# EAGLE design RK628H-22P-RevA (EAGLE 9.7.0)

## Sheet 1 of 6: Title Page
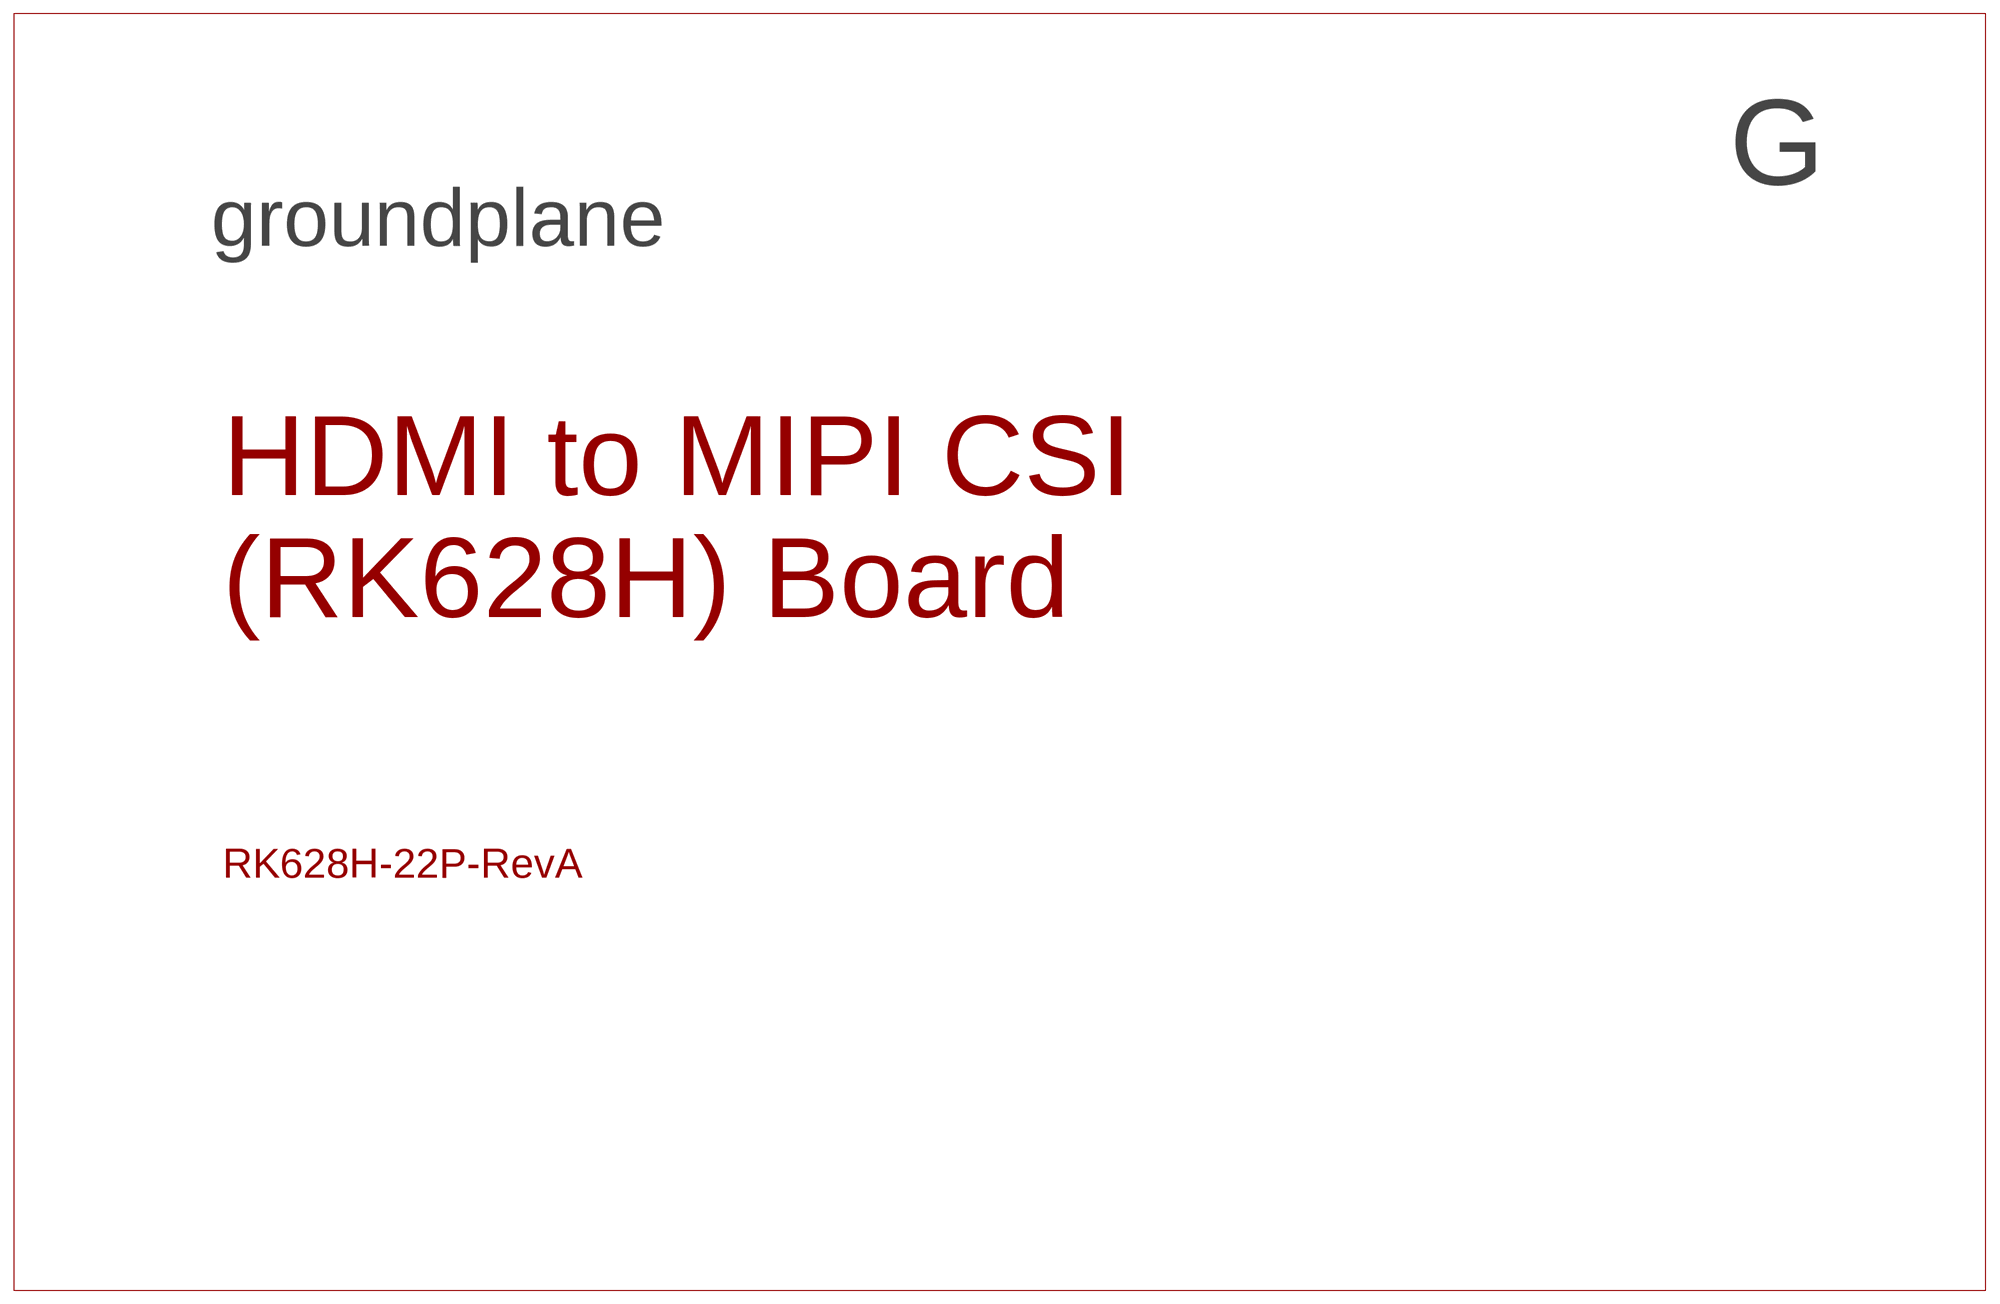
[diagram p0: schematic, sheet 1]

### Notes on the sheet
- HDMI to MIPI CSI 
  (RK628H) Board

## Sheet 2 of 6: Table of Contents
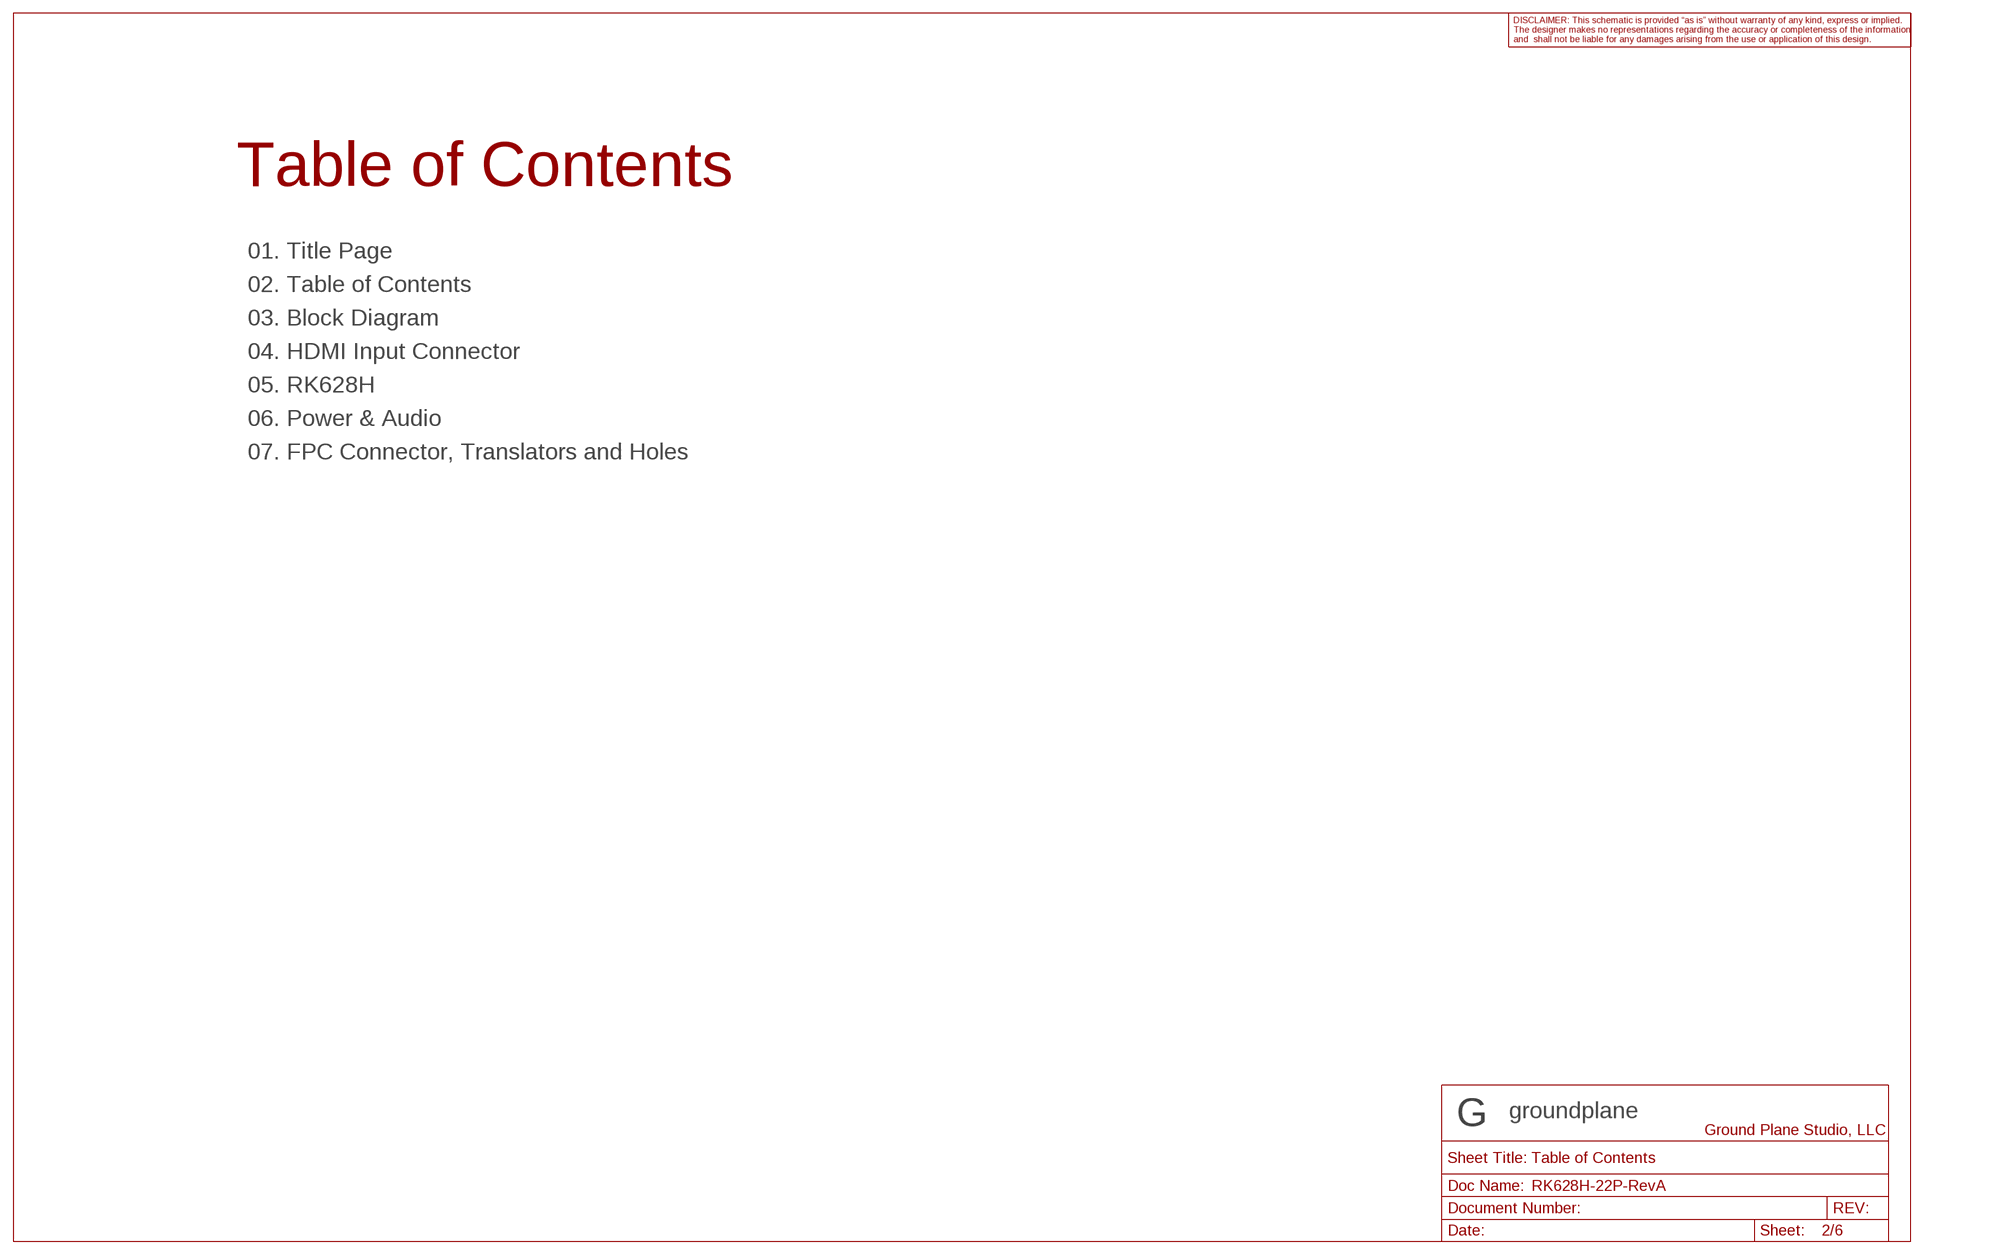
[diagram p1: schematic, sheet 2]

### Notes on the sheet
- 01. Title Page
- 02. Table of Contents
- 03. Block Diagram
- 04. HDMI Input Connector
- 05. RK628H
- 06. Power & Audio
- 07. FPC Connector, Translators and Holes

## Sheet 3 of 6: Block Diagram
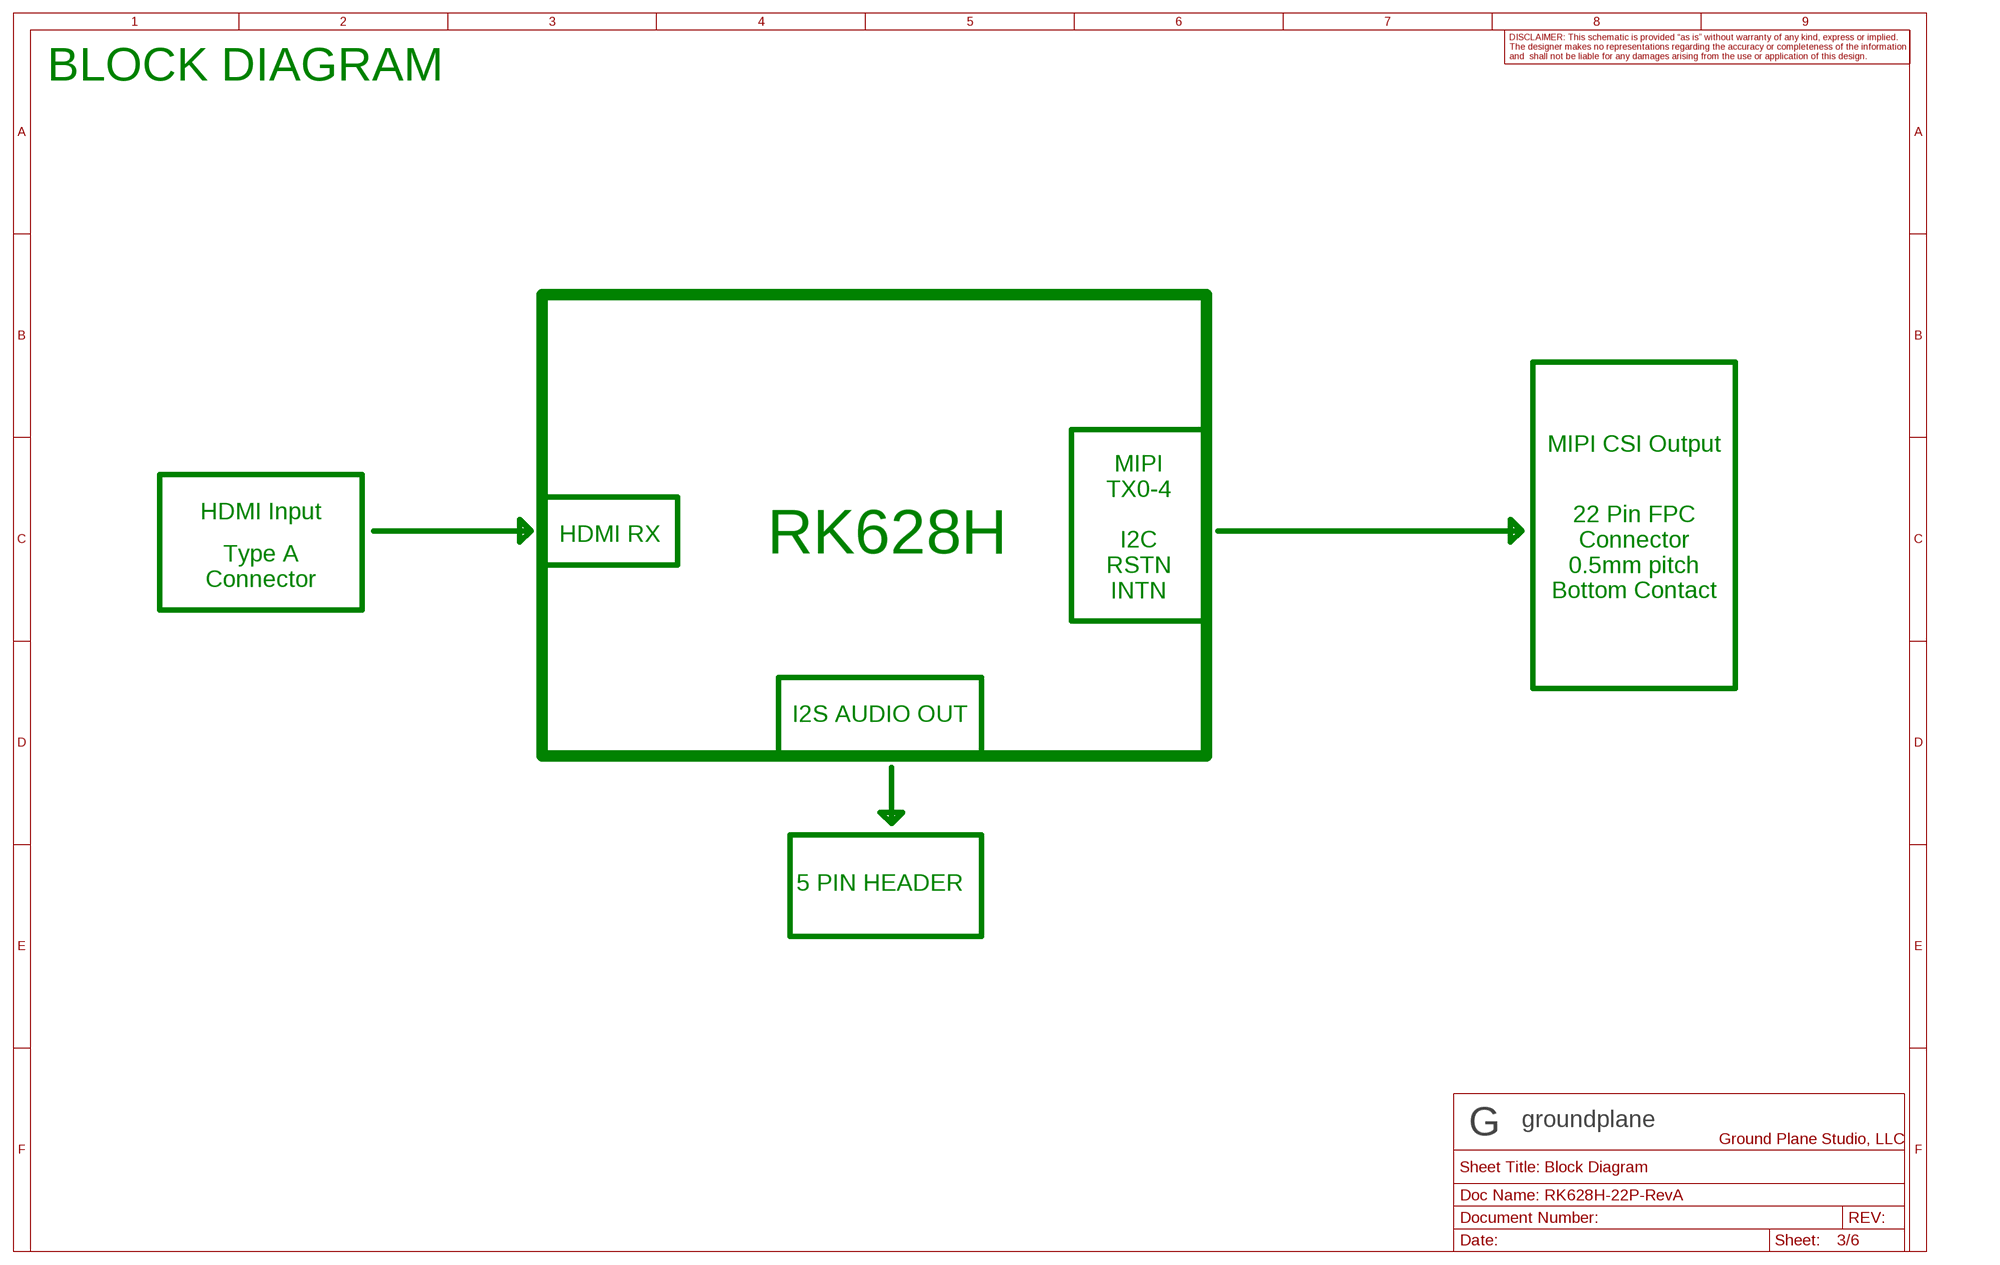
[diagram p2: schematic, sheet 3]

### Notes on the sheet
- BLOCK DIAGRAM
- MIPI CSI Output
- MIPI
  TX0-4
- HDMI Input
- HDMI RX
- RK628H
- Type A
  Connector
- I2C
  RSTN
  INTN
- 22 Pin FPC
  Connector
  0.5mm pitch
  Bottom Contact
- I2S AUDIO OUT
- 5 PIN HEADER

## Sheet 4 of 6: HDMI Input Connector/TVS/Filters
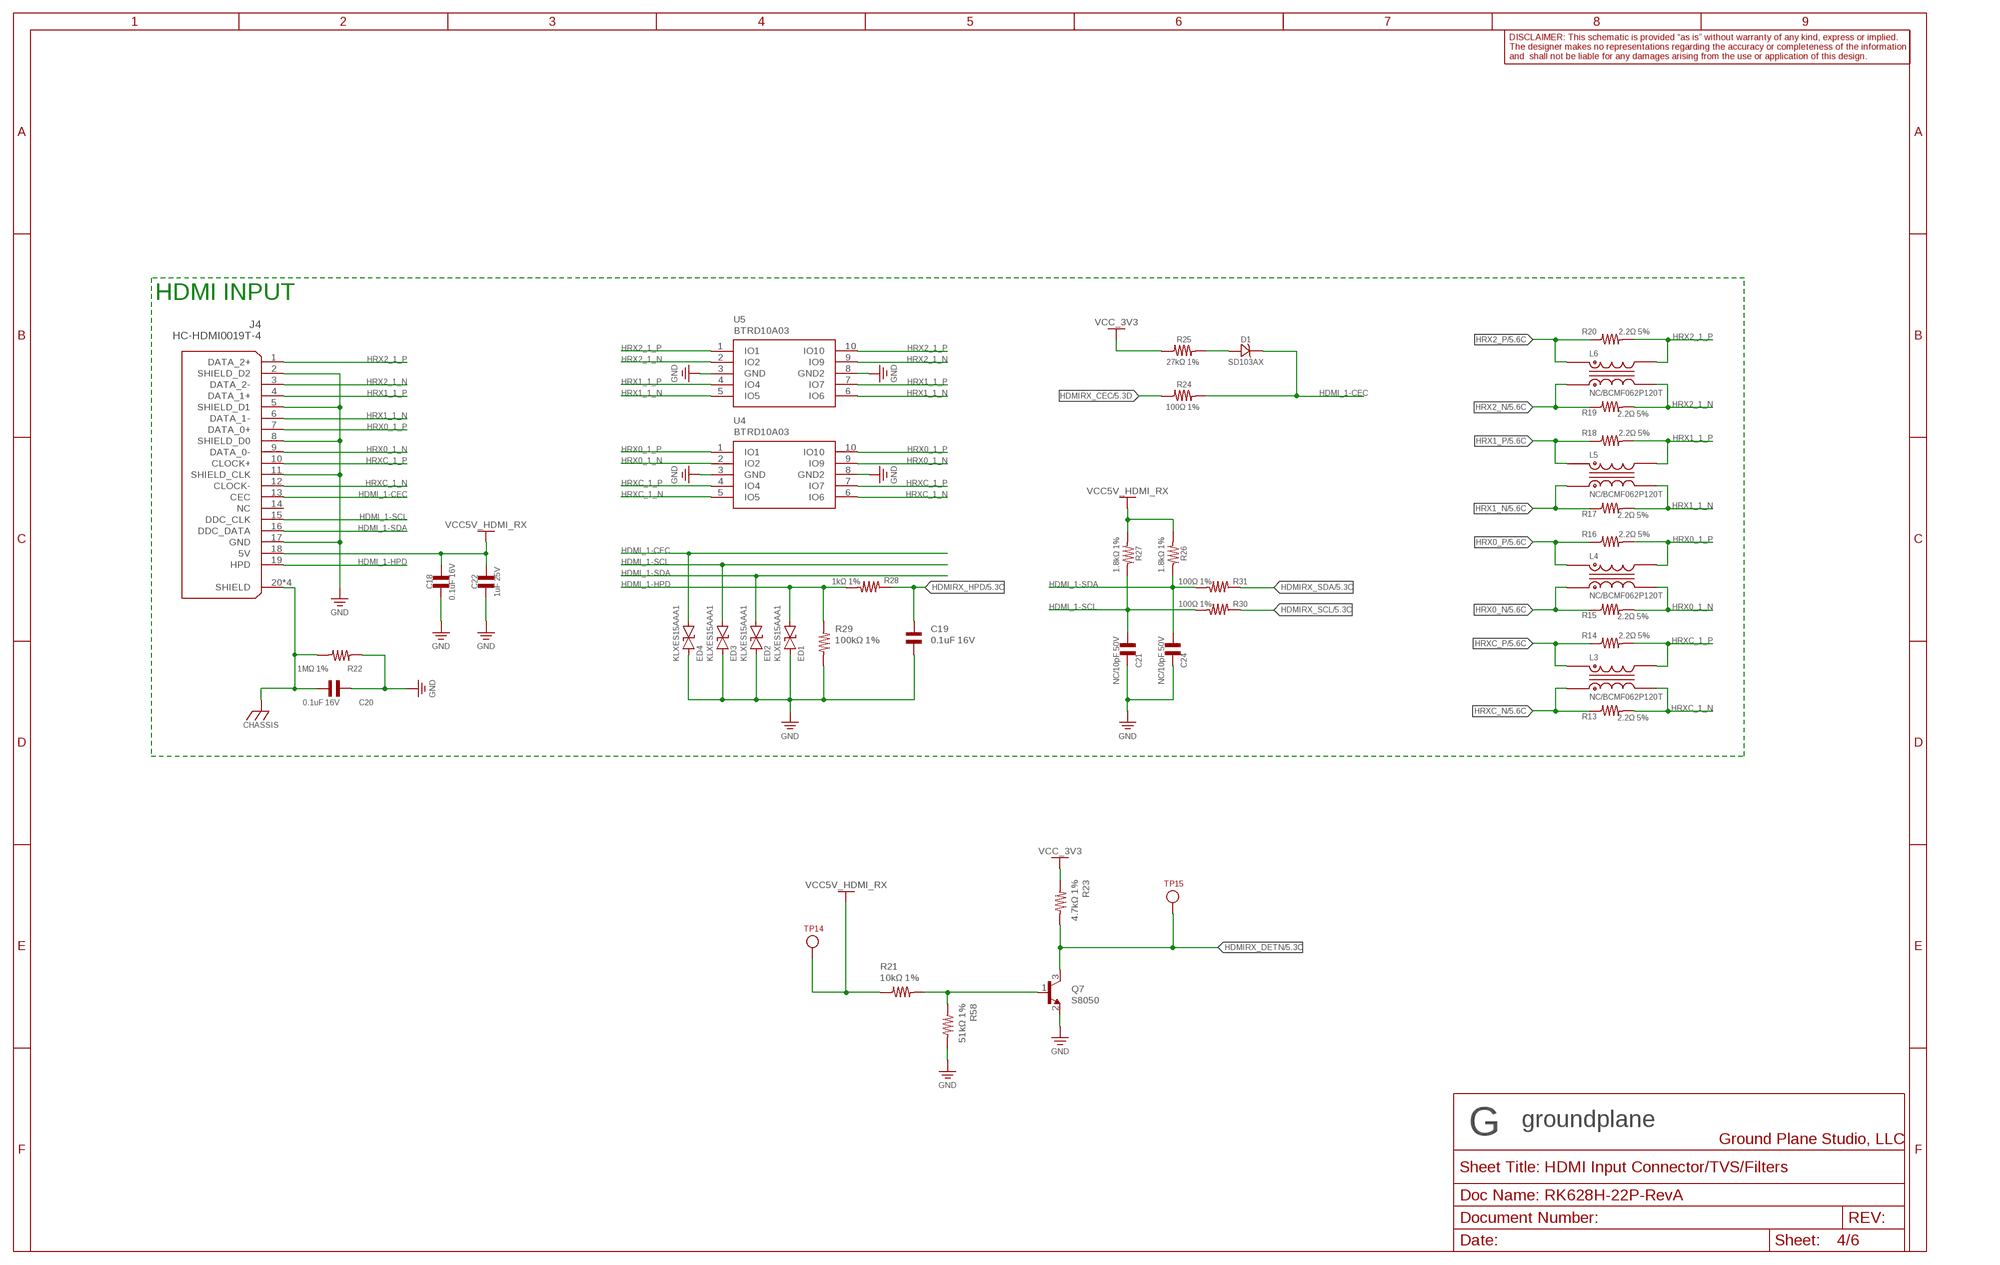
[diagram p3: schematic, sheet 4]

### Parts
C18  0.1uF 16V  CAP_0402_0.1UF_16V_X7R  [CAP_0402]
C19  0.1uF 16V  CAP_0402_0.1UF_16V_X7R  [CAP_0402]
C20  0.1uF 16V  CAP_0402_0.1UF_16V_X7R  [CAP_0402]
C21  NC/10pF 50V  CAP_0201_DNP_10PF_50V  [CAP_0201]
C22  1uF 25V  CAP_0402_1UF_25V_X5R  [CAP_0402]
C24  NC/10pF 50V  CAP_0201_DNP_10PF_50V  [CAP_0201]
D1  SD103AX  [SD103AX]
ED1  KLXES15AAA1  TVS_ESD_1CH_BI_KLXES15AAA1  [TVS_0402]
ED2  KLXES15AAA1  TVS_ESD_1CH_BI_KLXES15AAA1  [TVS_0402]
ED3  KLXES15AAA1  TVS_ESD_1CH_BI_KLXES15AAA1  [TVS_0402]
ED4  KLXES15AAA1  TVS_ESD_1CH_BI_KLXES15AAA1  [TVS_0402]
J4  HC-HDMI0019T-4  CONN_HDMI_A_HC-HDMI0019T-4  [CONN_HDMI_A_SMT_RA_HC-HDMI0019T-4]
L3  NC/BCMF062P120T  BCMF062P120T_BCMF062P120T_NC  [BCMF062P120T]
L4  NC/BCMF062P120T  BCMF062P120T_BCMF062P120T_NC  [BCMF062P120T]
L5  NC/BCMF062P120T  BCMF062P120T_BCMF062P120T_NC  [BCMF062P120T]
L6  NC/BCMF062P120T  BCMF062P120T_BCMF062P120T_NC  [BCMF062P120T]
Q7  S8050  NPN_S8050  [SOT-23-3]
R13  2.2Ω 5%  RES_0201_2R2_5%  [RES_0201]
R14  2.2Ω 5%  RES_0201_2R2_5%  [RES_0201]
R15  2.2Ω 5%  RES_0201_2R2_5%  [RES_0201]
R16  2.2Ω 5%  RES_0201_2R2_5%  [RES_0201]
R17  2.2Ω 5%  RES_0201_2R2_5%  [RES_0201]
R18  2.2Ω 5%  RES_0201_2R2_5%  [RES_0201]
R19  2.2Ω 5%  RES_0201_2R2_5%  [RES_0201]
R20  2.2Ω 5%  RES_0201_2R2_5%  [RES_0201]
R21  10kΩ 1%  RES_0402_10K_1%_1/16W  [RES_0402]
R22  1MΩ 1%  RES_0402_1M_1%  [RES_0402]
R23  4.7kΩ 1%  RES_0402_4K7_1%  [RES_0402]
R24  100Ω 1%  RES_0402_100R_1%  [RES_0402]
R25  27kΩ 1%  RES_0402_27K_1%  [RES_0402]
R26  1.8kΩ 1%  RES_0402_1K8_1%  [RES_0402]
R27  1.8kΩ 1%  RES_0402_1K8_1%  [RES_0402]
R28  1kΩ 1%  RES_0402_1K_1%  [RES_0402]
R29  100kΩ 1%  RES_0402_100K_1%_1/16W  [RES_0402]
R30  100Ω 1%  RES_0402_100R_1%  [RES_0402]
R31  100Ω 1%  RES_0402_100R_1%  [RES_0402]
R58  51kΩ 1%  RES_0402_51K_1%  [RES_0402]
TP14  TEST_POINT_1MM_0.5MM  TESTPOINT_1MM  [TEST_POINT_1MM]
TP15  TEST_POINT_1MM_0.5MM  TESTPOINT_1MM  [TEST_POINT_1MM]
U4  BTRD10A03  TVS_ESD_4CH_10P_PASS_THRU_BTRD10A03  [DFN2510-10]
U5  BTRD10A03  TVS_ESD_4CH_10P_PASS_THRU_BTRD10A03  [DFN2510-10]

### Nets
CGND: C20.2 J4.20(SHIELD) J4.21(SHIELD) J4.22(SHIELD) J4.23(SHIELD) R22.1 ; supply symbol labelled CHASSIS ; also sheet 6
GND: C18.1 C19.1 C20.1 C21.1 C22.1 C24.1 ED1.1 ED2.1 ED3.1 ED4.1 J4.2(SHIELD_D2) J4.5(SHIELD_D1) J4.8(SHIELD_D0) J4.11(SHIELD_CLK) J4.17(GND) Q7.2(E) R22.2 R29.1 R58.1 U4.3(GND) U4.8(GND2) U5.3(GND) U5.8(GND2) ; also sheet 5,6
HDMI_1-CEC: D1.C ED4.2 J4.13(CEC) R24.1
HDMI_1-HPD: ED1.2 J4.19(HPD) R28.1 R29.2
HDMI_1-SCL: C21.2 ED3.2 J4.15(DDC_CLK) R27.2 R30.1
HDMI_1-SDA: C24.2 ED2.2 J4.16(DDC_DATA) R26.2 R31.1
HDMIRX_CEC [50 ohm]: R24.2 ; also sheet 5
HDMIRX_DETN: Q7.3(C) R23.1 TP15.P$1 ; also sheet 5
HDMIRX_HPD: C19.2 R28.2 ; also sheet 5
HDMIRX_SCL [50 ohm]: R30.2 ; also sheet 5
HDMIRX_SDA [50 ohm]: R31.2 ; also sheet 5
HRX0_1_N [hdmi_diff]: J4.9(DATA_0-) L4.3 R15.1 U4.2(IO2) U4.9(IO9)
HRX0_1_P [hdmi_diff]: J4.7(DATA_0+) L4.4 R16.1 U4.1(IO1) U4.10(IO10)
HRX0_N [hdmi_diff]: L4.2 R15.2 ; also sheet 5
HRX0_P [hdmi_diff]: L4.1 R16.2 ; also sheet 5
HRX1_1_N [hdmi_diff]: J4.6(DATA_1-) L5.3 R17.1 U5.5(IO5) U5.6(IO6)
HRX1_1_P [hdmi_diff]: J4.4(DATA_1+) L5.4 R18.1 U5.4(IO4) U5.7(IO7)
HRX1_N [hdmi_diff]: L5.2 R17.2 ; also sheet 5
HRX1_P [hdmi_diff]: L5.1 R18.2 ; also sheet 5
HRX2_1_N [hdmi_diff]: J4.3(DATA_2-) L6.3 R19.1 U5.2(IO2) U5.9(IO9)
HRX2_1_P [hdmi_diff]: J4.1(DATA_2+) L6.4 R20.1 U5.1(IO1) U5.10(IO10)
HRX2_N [hdmi_diff]: L6.2 R19.2 ; also sheet 5
HRX2_P [hdmi_diff]: L6.1 R20.2 ; also sheet 5
HRXC_1_N [hdmi_diff]: J4.12(CLOCK-) L3.3 R13.1 U4.5(IO5) U4.6(IO6)
HRXC_1_P [hdmi_diff]: J4.10(CLOCK+) L3.4 R14.1 U4.4(IO4) U4.7(IO7)
HRXC_N [hdmi_diff]: L3.2 R13.2 ; also sheet 5
HRXC_P [hdmi_diff]: L3.1 R14.2 ; also sheet 5
N$11: D1.A R25.1
N$44: Q7.1(B) R21.1 R58.2
VCC5V_HDMI_RX: C18.2 C22.2 J4.18(5V) R21.2 R26.1 R27.1 TP14.P$1
VCC_3V3: R23.2 R25.2 ; also sheet 5,6
Unconnected: J4.14(NC)

### Notes on the sheet
- HDMI INPUT

## Sheet 5 of 6: HDMI TO CSI - RK628H
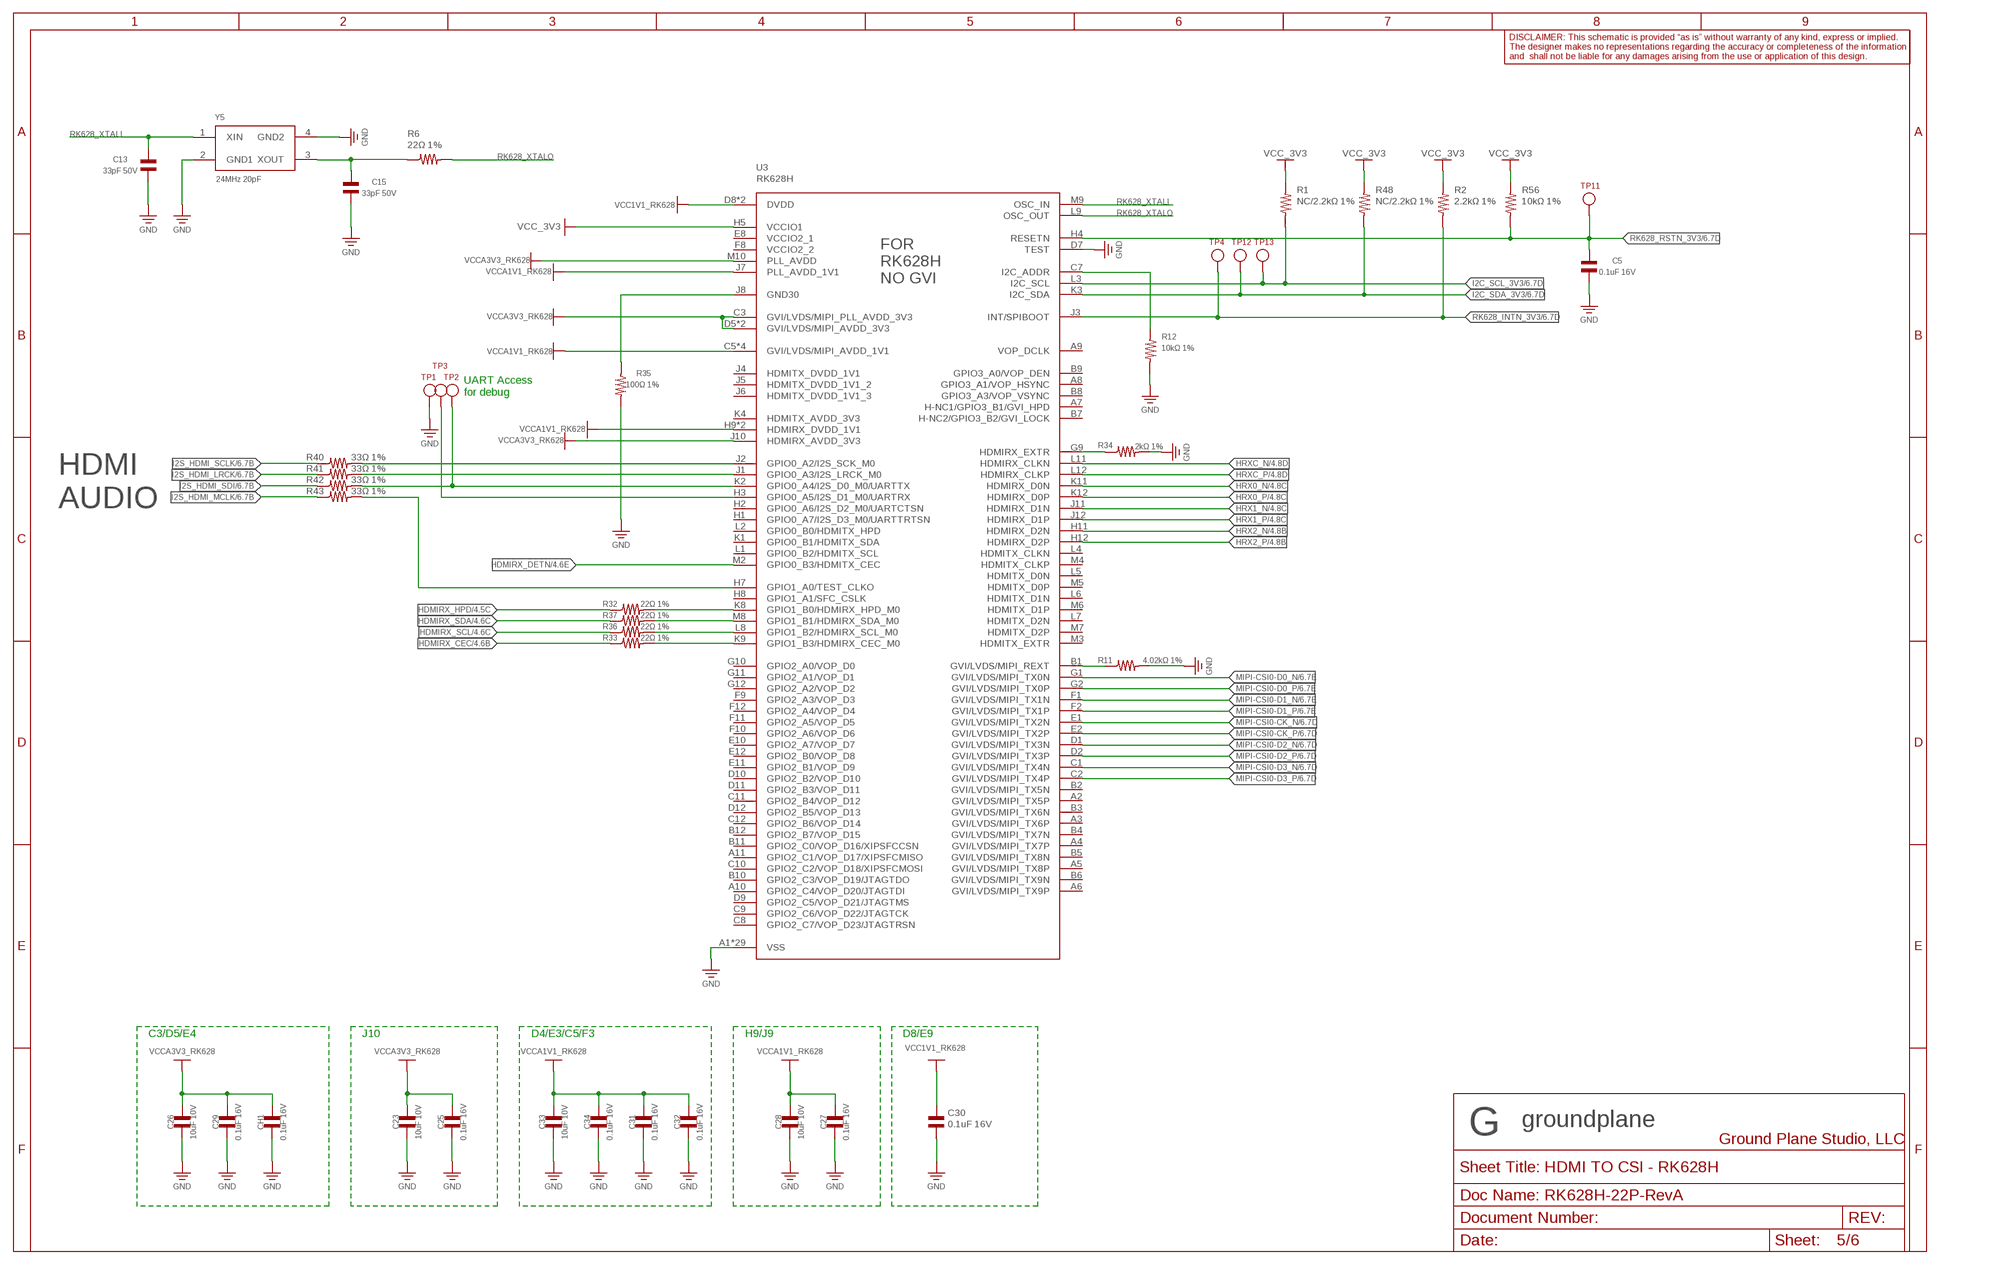
[diagram p4: schematic, sheet 5]

### Parts
C5  0.1uF 16V  CAP_0402_0.1UF_16V_X7R  [CAP_0402]
C13  33pF 50V  CAP_0402_33PF_50V  [CAP_0402]
C15  33pF 50V  CAP_0402_33PF_50V  [CAP_0402]
C23  10uF 10V  CAP_0402_10UF_10V_X5R  [CAP_0402]
C25  0.1uF 16V  CAP_0402_0.1UF_16V_X7R  [CAP_0402]
C26  10uF 10V  CAP_0402_10UF_10V_X5R  [CAP_0402]
C27  0.1uF 16V  CAP_0402_0.1UF_16V_X7R  [CAP_0402]
C28  10uF 10V  CAP_0402_10UF_10V_X5R  [CAP_0402]
C29  0.1uF 16V  CAP_0402_0.1UF_16V_X7R  [CAP_0402]
C30  0.1uF 16V  CAP_0402_0.1UF_16V_X7R  [CAP_0402]
C31  0.1uF 16V  CAP_0402_0.1UF_16V_X7R  [CAP_0402]
C32  0.1uF 16V  CAP_0402_0.1UF_16V_X7R  [CAP_0402]
C33  10uF 10V  CAP_0402_10UF_10V_X5R  [CAP_0402]
C34  0.1uF 16V  CAP_0402_0.1UF_16V_X7R  [CAP_0402]
CH1  0.1uF 16V  CAP_0402_0.1UF_16V_X7R  [CAP_0402]
R1  NC/2.2kΩ 1%  RES_0402_DNP_2K2_1%  [RES_0402]
R2  2.2kΩ 1%  RES_0402_2K2_1%  [RES_0402]
R6  22Ω 1%  RES_0402_22R_1%  [RES_0402]
R11  4.02kΩ 1%  RES_0402_4K02_1%  [RES_0402]
R12  10kΩ 1%  RES_0402_10K_1%_1/16W  [RES_0402]
R32  22Ω 1%  RES_0402_22R_1%  [RES_0402]
R33  22Ω 1%  RES_0402_22R_1%  [RES_0402]
R34  2kΩ 1%  RES_0402_2K_1%_1/16W  [RES_0402]
R35  100Ω 1%  RES_0402_100R_1%  [RES_0402]
R36  22Ω 1%  RES_0402_22R_1%  [RES_0402]
R37  22Ω 1%  RES_0402_22R_1%  [RES_0402]
R40  33Ω 1%  RES_0402_33R_1%  [RES_0402]
R41  33Ω 1%  RES_0402_33R_1%  [RES_0402]
R42  33Ω 1%  RES_0402_33R_1%  [RES_0402]
R43  33Ω 1%  RES_0402_33R_1%  [RES_0402]
R48  NC/2.2kΩ 1%  RES_0402_DNP_2K2_1%  [RES_0402]
R56  10kΩ 1%  RES_0402_10K_1%_1/16W  [RES_0402]
TP1  TESTPOINT_1MM  [TEST_POINT_1MM]
TP2  TESTPOINT_1MM  [TEST_POINT_1MM]
TP3  TESTPOINT_1MM  [TEST_POINT_1MM]
TP4  TEST_POINT_1MM_0.5MM  TESTPOINT_1MM  [TEST_POINT_1MM]
TP11  TESTPOINT_1MM  [TEST_POINT_1MM]
TP12  TEST_POINT_1MM_0.5MM  TESTPOINT_1MM  [TEST_POINT_1MM]
TP13  TEST_POINT_1MM_0.5MM  TESTPOINT_1MM  [TEST_POINT_1MM]
U3  RK628H  IF_VIDEO_BRIDGE_RK628F/H_RK628H  [WBBGA144_8X8MM]
Y5  24MHz 20pF  CRYSTAL_SMD2016-4P_24MHZ_20PF_10PPM_T201624MLBDE2X  [CRYSTAL_SMD2016-4P]

### Nets
GND: C5.1 C13.1 C15.1 C23.1 C25.1 C26.1 C27.1 C28.1 C29.1 C30.2 C31.1 C32.1 C33.1 C34.1 CH1.1 R11.1 R12.1 R34.1 R35.2 TP1.P$1 U3.A1(VSS) U3.A12(VSS) U3.C4(VSS) U3.C6(VSS) U3.D3(VSS) U3.D6(VSS) U3.D7(TEST) U3.E5(VSS) U3.E6(VSS) U3.E7(VSS) U3.F4(VSS) U3.F5(VSS) U3.F6(VSS) U3.F7(VSS) U3.G3(VSS) U3.G4(VSS) U3.G5(VSS) U3.G6(VSS) U3.G7(VSS) U3.G8(VSS) U3.H6(VSS) U3.H10(VSS) U3.K5(VSS) U3.K6(VSS) U3.K7(VSS) U3.K10(VSS) U3.L10(VSS) U3.M1(VSS) U3.M11(VSS) U3.M12(VSS) Y5.2(GND1) Y5.4(GND2) ; also sheet 4,6
HDMIRX_CEC [50 ohm]: R33.2 ; also sheet 4
HDMIRX_DETN: U3.M2(GPIO0_B3/HDMITX_CEC) ; also sheet 4
HDMIRX_HPD: R32.2 ; also sheet 4
HDMIRX_SCL [50 ohm]: R36.2 ; also sheet 4
HDMIRX_SDA [50 ohm]: R37.2 ; also sheet 4
HRX0_N [hdmi_diff]: U3.K11(HDMIRX_D0N) ; also sheet 4
HRX0_P [hdmi_diff]: U3.K12(HDMIRX_D0P) ; also sheet 4
HRX1_N [hdmi_diff]: U3.J11(HDMIRX_D1N) ; also sheet 4
HRX1_P [hdmi_diff]: U3.J12(HDMIRX_D1P) ; also sheet 4
HRX2_N [hdmi_diff]: U3.H11(HDMIRX_D2N) ; also sheet 4
HRX2_P [hdmi_diff]: U3.H12(HDMIRX_D2P) ; also sheet 4
HRXC_N [hdmi_diff]: U3.L11(HDMIRX_CLKN) ; also sheet 4
HRXC_P [hdmi_diff]: U3.L12(HDMIRX_CLKP) ; also sheet 4
I2C_SCL_3V3: R1.1 TP13.P$1 U3.L3(I2C_SCL) ; also sheet 6
I2C_SDA_3V3: R48.1 TP12.P$1 U3.K3(I2C_SDA) ; also sheet 6
I2S_HDMI_LRCK [50 ohm]: R41.2 ; also sheet 6
I2S_HDMI_MCLK [50 ohm]: R43.2 ; also sheet 6
I2S_HDMI_SCLK [50 ohm]: R40.2 ; also sheet 6
I2S_HDMI_SDI [50 ohm]: R42.2 ; also sheet 6
MIPI-CSI0-CK_N [hdmi_diff]: U3.E1(GVI/LVDS/MIPI_TX2N) ; also sheet 6
MIPI-CSI0-CK_P [hdmi_diff]: U3.E2(GVI/LVDS/MIPI_TX2P) ; also sheet 6
MIPI-CSI0-D0_N [hdmi_diff]: U3.G1(GVI/LVDS/MIPI_TX0N) ; also sheet 6
MIPI-CSI0-D0_P [hdmi_diff]: U3.G2(GVI/LVDS/MIPI_TX0P) ; also sheet 6
MIPI-CSI0-D1_N [hdmi_diff]: U3.F1(GVI/LVDS/MIPI_TX1N) ; also sheet 6
MIPI-CSI0-D1_P [hdmi_diff]: U3.F2(GVI/LVDS/MIPI_TX1P) ; also sheet 6
MIPI-CSI0-D2_N [hdmi_diff]: U3.D1(GVI/LVDS/MIPI_TX3N) ; also sheet 6
MIPI-CSI0-D2_P [hdmi_diff]: U3.D2(GVI/LVDS/MIPI_TX3P) ; also sheet 6
MIPI-CSI0-D3_N [hdmi_diff]: U3.C1(GVI/LVDS/MIPI_TX4N) ; also sheet 6
MIPI-CSI0-D3_P [hdmi_diff]: U3.C2(GVI/LVDS/MIPI_TX4P) ; also sheet 6
N$2: C15.2 R6.2 Y5.3(XOUT)
N$15 [50 ohm]: R40.1 U3.J2(GPIO0_A2/I2S_SCK_M0)
N$16 [50 ohm]: R41.1 U3.J1(GPIO0_A3/I2S_LRCK_M0)
N$18 [50 ohm]: R42.1 TP2.P$1 U3.K2(GPIO0_A4/I2S_D0_M0/UARTTX)
N$22 [50 ohm]: R43.1 U3.H7(GPIO1_A0/TEST_CLKO)
N$24: R11.2 U3.B1(GVI/LVDS/MIPI_REXT)
N$25: R34.2 U3.G9(HDMIRX_EXTR)
N$94: R32.1 U3.K8(GPIO1_B0/HDMIRX_HPD_M0)
N$95: R37.1 U3.M8(GPIO1_B1/HDMIRX_SDA_M0)
N$96: R36.1 U3.L8(GPIO1_B2/HDMIRX_SCL_M0)
N$97: R33.1 U3.K9(GPIO1_B3/HDMIRX_CEC_M0)
N$99: R35.1 U3.J8(GND30)
N$108: TP3.P$1 U3.H3(GPIO0_A5/I2S_D1_M0/UARTRX)
N$110: R12.2 U3.C7(I2C_ADDR)
RK628_INTN_3V3: R2.1 TP4.P$1 U3.J3(INT/SPIBOOT) ; also sheet 6
RK628_RSTN_3V3: C5.2 R56.1 TP11.P$1 U3.H4(RESETN) ; also sheet 6
RK628_XTALI: C13.2 U3.M9(OSC_IN) Y5.1(XIN)
RK628_XTALO: R6.1 U3.L9(OSC_OUT)
VCC1V1_RK628: C30.1 U3.D8(DVDD) U3.E9(DVDD) ; also sheet 6
VCC_3V3: R1.2 R2.2 R48.2 R56.2 U3.H5(VCCIO1) ; also sheet 4,6
VCCA1V1_RK628: C27.2 C28.2 C31.2 C32.2 C33.2 C34.2 U3.C5(GVI/LVDS/MIPI_AVDD_1V1) U3.D4(GVI/LVDS/MIPI_AVDD_1V1) U3.E3(GVI/LVDS/MIPI_AVDD_1V1) U3.F3(GVI/LVDS/MIPI_AVDD_1V1) U3.H9(HDMIRX_DVDD_1V1) U3.J7(PLL_AVDD_1V1) U3.J9(HDMIRX_DVDD_1V1) ; also sheet 6
VCCA3V3_RK628: C23.2 C25.2 C26.2 C29.2 CH1.2 U3.C3(GVI/LVDS/MIPI_PLL_AVDD_3V3) U3.D5(GVI/LVDS/MIPI_AVDD_3V3) U3.E4(GVI/LVDS/MIPI_AVDD_3V3) U3.J10(HDMIRX_AVDD_3V3) U3.M10(PLL_AVDD) ; also sheet 6
Unconnected: U3.A2(GVI/LVDS/MIPI_TX5P) U3.A3(GVI/LVDS/MIPI_TX6P) U3.A4(GVI/LVDS/MIPI_TX7P) U3.A5(GVI/LVDS/MIPI_TX8P) U3.A6(GVI/LVDS/MIPI_TX9P) U3.A7(H-NC1/GPIO3_B1/GVI_HPD) U3.A8(GPIO3_A1/VOP_HSYNC) U3.A9(VOP_DCLK) U3.A10(GPIO2_C4/VOP_D20/JTAGTDI) U3.A11(GPIO2_C1/VOP_D17/XIPSFCMISO) U3.B2(GVI/LVDS/MIPI_TX5N) U3.B3(GVI/LVDS/MIPI_TX6N) U3.B4(GVI/LVDS/MIPI_TX7N) U3.B5(GVI/LVDS/MIPI_TX8N) U3.B6(GVI/LVDS/MIPI_TX9N) U3.B7(H-NC2/GPIO3_B2/GVI_LOCK) U3.B8(GPIO3_A3/VOP_VSYNC) U3.B9(GPIO3_A0/VOP_DEN) U3.B10(GPIO2_C3/VOP_D19/JTAGTDO) U3.B11(GPIO2_C0/VOP_D16/XIPSFCCSN) U3.B12(GPIO2_B7/VOP_D15) U3.C8(GPIO2_C7/VOP_D23/JTAGTRSN) U3.C9(GPIO2_C6/VOP_D22/JTAGTCK) U3.C10(GPIO2_C2/VOP_D18/XIPSFCMOSI) U3.C11(GPIO2_B4/VOP_D12) U3.C12(GPIO2_B6/VOP_D14) U3.D9(GPIO2_C5/VOP_D21/JTAGTMS) U3.D10(GPIO2_B2/VOP_D10) U3.D11(GPIO2_B3/VOP_D11) U3.D12(GPIO2_B5/VOP_D13) U3.E10(GPIO2_A7/VOP_D7) U3.E11(GPIO2_B1/VOP_D9) U3.E12(GPIO2_B0/VOP_D8) U3.F9(GPIO2_A3/VOP_D3) U3.F10(GPIO2_A6/VOP_D6) U3.F11(GPIO2_A5/VOP_D5) U3.F12(GPIO2_A4/VOP_D4) U3.G10(GPIO2_A0/VOP_D0) U3.G11(GPIO2_A1/VOP_D1) U3.G12(GPIO2_A2/VOP_D2) U3.H1(GPIO0_A7/I2S_D3_M0/UARTTRTSN) U3.H2(GPIO0_A6/I2S_D2_M0/UARTCTSN) U3.H8(GPIO1_A1/SFC_CSLK) U3.K1(GPIO0_B1/HDMITX_SDA) U3.L1(GPIO0_B2/HDMITX_SCL) U3.L2(GPIO0_B0/HDMITX_HPD) U3.L4(HDMITX_CLKN) U3.L5(HDMITX_D0N) U3.L6(HDMITX_D1N) U3.L7(HDMITX_D2N) U3.M3(HDMITX_EXTR) U3.M4(HDMITX_CLKP) U3.M5(HDMITX_D0P) U3.M6(HDMITX_D1P) U3.M7(HDMITX_D2P)

### Notes on the sheet
- UART Access
  for debug
- HDMI 
  AUDIO
- C3/D5/E4 | J10 | D4/E3/C5/F3 | H9/J9 | D8/E9

## Sheet 6 of 6: Power & Audio
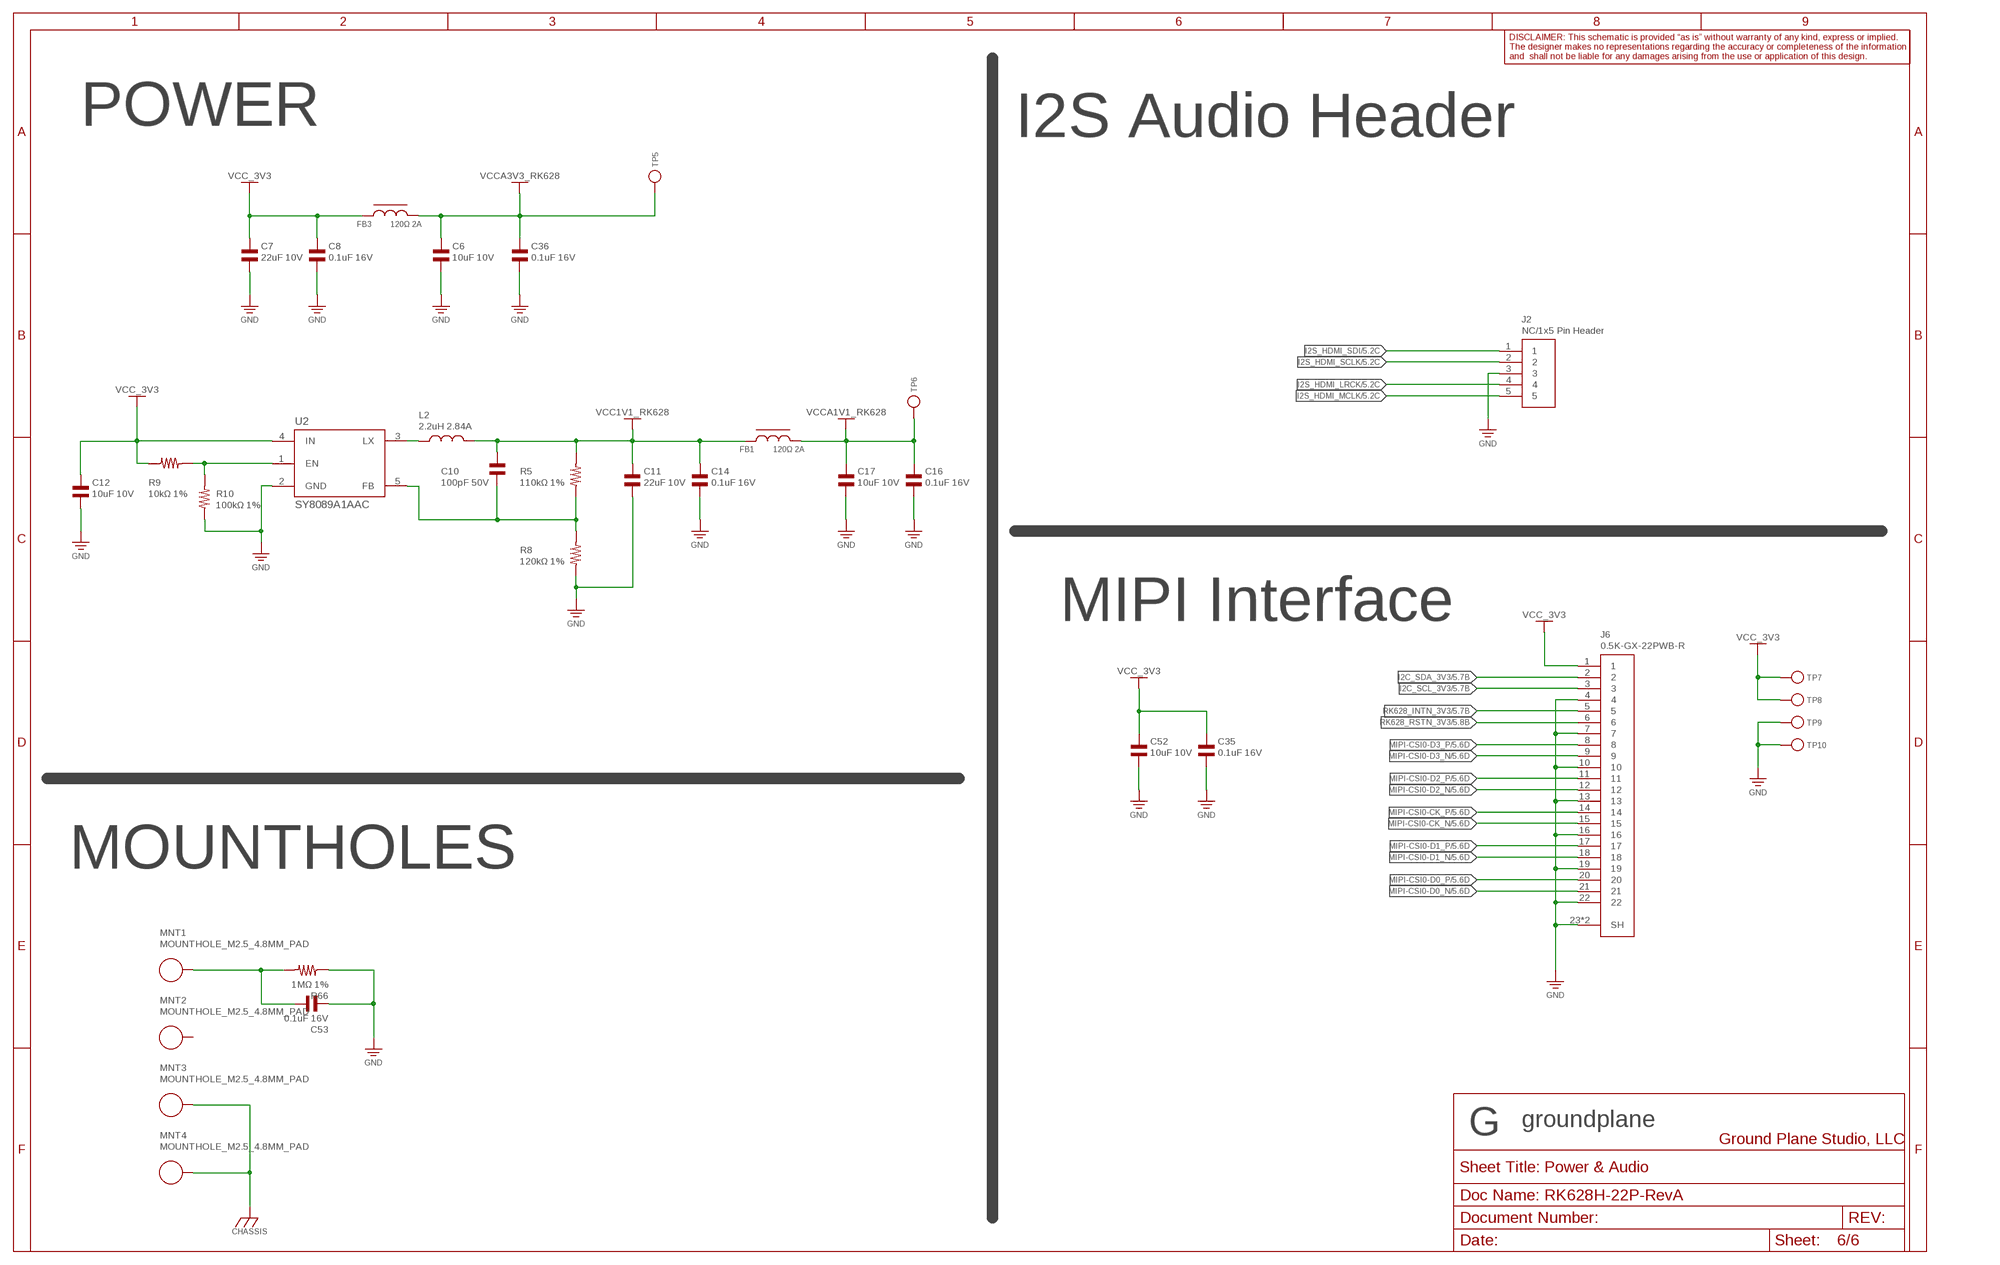
[diagram p5: schematic, sheet 6]

### Parts
C6  10uF 10V  CAP_0402_10UF_10V_X5R  [CAP_0402]
C7  22uF 10V  CAP_0603_22UF_10V_X5R  [CAP_0603]
C8  0.1uF 16V  CAP_0402_0.1UF_16V_X7R  [CAP_0402]
C10  100pF 50V  CAP_0402_100PF_50V_NP0  [CAP_0402]
C11  22uF 10V  CAP_0603_22UF_10V_X5R  [CAP_0603]
C12  10uF 10V  CAP_0402_10UF_10V_X5R  [CAP_0402]
C14  0.1uF 16V  CAP_0402_0.1UF_16V_X7R  [CAP_0402]
C16  0.1uF 16V  CAP_0402_0.1UF_16V_X7R  [CAP_0402]
C17  10uF 10V  CAP_0402_10UF_10V_X5R  [CAP_0402]
C35  0.1uF 16V  CAP_0402_0.1UF_16V_X7R  [CAP_0402]
C36  0.1uF 16V  CAP_0402_0.1UF_16V_X7R  [CAP_0402]
C52  10uF 10V  CAP_0402_10UF_10V_X5R  [CAP_0402]
C53  0.1uF 16V  CAP_0402_0.1UF_16V_X7R  [CAP_0402]
FB1  120Ω 2A  FERRITE_0603_120R_2A  [IND_0603]
FB3  120Ω 2A  FERRITE_0603_120R_2A  [IND_0603]
J2  NC/1x5 Pin Header  HDR_1X05_DNP_2.54MM_TH_ST  [HDR_1X05_2.54MM_TH_ST]
J6  0.5K-GX-22PWB-R  CONN_FFC_1X22_SH_0.5MM_SM_RA_0.5K-GX-22PWB-R  [CONN_FFC_1X22_0.5MM_SM_RA_0.5K-GX-22PWB-R]
L2  2.2uH 2.84A  IND_3MM_SQ_2.2UH_2.84A_1.2MM_HEIGHT  [IND_3MM_SQ_1.2MM_HEIGHT]
MNT1  MOUNTHOLE_M2.5_4.8MM_PAD  [MOUNTHOLE_M2.5_4.8MM_PAD]
MNT2  MOUNTHOLE_M2.5_4.8MM_PAD  [MOUNTHOLE_M2.5_4.8MM_PAD]
MNT3  MOUNTHOLE_M2.5_4.8MM_PAD  [MOUNTHOLE_M2.5_4.8MM_PAD]
MNT4  MOUNTHOLE_M2.5_4.8MM_PAD  [MOUNTHOLE_M2.5_4.8MM_PAD]
R5  110kΩ 1%  RES_0402_110K_1%  [RES_0402]
R8  120kΩ 1%  RES_0402_120K_1%  [RES_0402]
R9  10kΩ 1%  RES_0402_10K_1%_1/16W  [RES_0402]
R10  100kΩ 1%  RES_0402_100K_1%_1/16W  [RES_0402]
R66  1MΩ 1%  RES_0402_1M_1%  [RES_0402]
TP5  TESTPOINT_1MM  [TEST_POINT_1MM]
TP6  TESTPOINT_1MM  [TEST_POINT_1MM]
TP7  TESTPOINT_1MM  [TEST_POINT_1MM]
TP8  TESTPOINT_1MM  [TEST_POINT_1MM]
TP9  TESTPOINT_1MM  [TEST_POINT_1MM]
TP10  TESTPOINT_1MM  [TEST_POINT_1MM]
U2  SY8089A1AAC  SY8089A1AAC_SY8089A1AAC  [SOT95P285X110-5N]

### Nets
CGND: MNT3.P$1 MNT4.P$1 ; supply symbol labelled CHASSIS ; also sheet 4
GND: C6.1 C7.1 C8.1 C11.1 C12.1 C14.1 C16.1 C17.1 C35.2 C36.1 C52.2 C53.1 J2.3 J6.4 J6.7 J6.10 J6.13 J6.16 J6.19 J6.22 J6.23(SH) J6.24(SH) R8.2 R10.2 R66.2 TP9.P$1 TP10.P$1 U2.2(GND) ; also sheet 4,5
I2C_SCL_3V3: J6.3 ; also sheet 5
I2C_SDA_3V3: J6.2 ; also sheet 5
I2S_HDMI_LRCK [50 ohm]: J2.4 ; also sheet 5
I2S_HDMI_MCLK [50 ohm]: J2.5 ; also sheet 5
I2S_HDMI_SCLK [50 ohm]: J2.2 ; also sheet 5
I2S_HDMI_SDI [50 ohm]: J2.1 ; also sheet 5
MIPI-CSI0-CK_N [hdmi_diff]: J6.15 ; also sheet 5
MIPI-CSI0-CK_P [hdmi_diff]: J6.14 ; also sheet 5
MIPI-CSI0-D0_N [hdmi_diff]: J6.21 ; also sheet 5
MIPI-CSI0-D0_P [hdmi_diff]: J6.20 ; also sheet 5
MIPI-CSI0-D1_N [hdmi_diff]: J6.18 ; also sheet 5
MIPI-CSI0-D1_P [hdmi_diff]: J6.17 ; also sheet 5
MIPI-CSI0-D2_N [hdmi_diff]: J6.12 ; also sheet 5
MIPI-CSI0-D2_P [hdmi_diff]: J6.11 ; also sheet 5
MIPI-CSI0-D3_N [hdmi_diff]: J6.9 ; also sheet 5
MIPI-CSI0-D3_P [hdmi_diff]: J6.8 ; also sheet 5
N$23: L2.1 U2.3(LX)
N$26: C53.2 MNT1.P$1 R66.1
N$120: C10.1 R5.2 R8.1 U2.5(FB)
N$157: R9.1 R10.1 U2.1(EN)
RK628_INTN_3V3: J6.5 ; also sheet 5
RK628_RSTN_3V3: J6.6 ; also sheet 5
VCC1V1_RK628: C10.2 C11.2 C14.2 FB1.1 L2.2 R5.1 ; also sheet 5
VCC_3V3: C7.2 C8.2 C12.2 C35.1 C52.1 FB3.1 J6.1 R9.2 TP7.P$1 TP8.P$1 U2.4(IN) ; also sheet 4,5
VCCA1V1_RK628: C16.2 C17.2 FB1.2 TP6.P$1 ; also sheet 5
VCCA3V3_RK628: C6.2 C36.2 FB3.2 TP5.P$1 ; also sheet 5
Unconnected: MNT2.P$1

### Notes on the sheet
- POWER | I2S Audio Header
- MIPI Interface
- MOUNTHOLES

## Power pins joined to a net without a drawn wire
HDMITX_AVDD_3V3: U3.K4(HDMITX_AVDD_3V3)
HDMITX_DVDD_1V1: U3.J4(HDMITX_DVDD_1V1)
HDMITX_DVDD_1V1_2: U3.J5(HDMITX_DVDD_1V1_2)
HDMITX_DVDD_1V1_3: U3.J6(HDMITX_DVDD_1V1_3)
VCCIO2_1: U3.E8(VCCIO2_1)
VCCIO2_2: U3.F8(VCCIO2_2)

## Library data of the parts
C5 C8 C14 C16 C18-C20 C25 C27 C29-C32 C34-C36 C53 CH1 = !GPLIB_PASSIVE:CAP_0402; JLCPCB: C1525; JLC_PARTS_TYPE: BASIC; MF: Samsung Electro-Mechanics; MP: CL05B104KO5NNNC
C6 C12 C17 C23 C26 C28 C33 C52 = !GPLIB_PASSIVE:CAP_0402; JLCPCB: C315248; MF: Samsung Electro-Mechanics; MP: CL05A106MP5NUNC
C7 C11 = !GPLIB_PASSIVE:CAP_0603; JLCPCB: C7432770; MF: Chinocera; MP: HGC0603R5226M100NTHJ
C10 = !GPLIB_PASSIVE:CAP_0402; JLCPCB: C106200; MF: YAGEO; MP: CC0402JRNPO9BN101
C13 C15 = !GPLIB_PASSIVE:CAP_0402; JLCPCB: C1562; MF: FH (Guangdong Fenghua Advanced Tech); MP: 0402CG330J500NT
C21 C24 = !GPLIB_PASSIVE:CAP_0201
C22 = !GPLIB_PASSIVE:CAP_0402; JLCPCB: C52923; JLC_PARTS_TYPE: Basic; MF: Samsung Electro-Mechanics; MP: CL05A105KA5NQNC
D1 = groundplane:SD103AX; JLCPCB: C20416650; MF: BORN; MP: SD103AX
ED1-ED4 = !GPLIB_ACTIVE:TVS_ESD_1CH_BI; JLCPCB: C2892490; MF: KUU; MP: KLXES15AAA1
FB1 FB3 = !GPLIB_PASSIVE:FERRITE_0603; JLCPCB: C14709; JLC_FOOTPRINT: TRUE; JLC_PARTS_TYPE: Basic; MF: Murata Electronics; MP: BLM18PG121SN1D
J2 = !GPLIB_CONN:HDR_1X05; JLC-ROTATION: 0; JLC-X-OFFSET: 5.08; JLC-Y-OFFSET: 0; JLCPCB: C2932699
J4 = !GPLIB_CONN:CONN_HDMI_A; JLC-Y-OFFSET: 2.75; JLCPCB: C7501811; MF: Hong Cheng; MP: HC-HDMI0019T-4
J6 = !GPLIB_CONN:CONN_FFC_1X22_SH; JLCPCB: C53223210; MF: GUOCONN; MP: 0.5K-GX-22PWB-R
L2 = !GPLIB_PASSIVE:IND_3MM_SQ; JLCPCB: C404494; MF: TDK; MP: VLS3012HBX-2R2M
L3-L6 = groundplane:BCMF062P120T
MNT1-MNT4 = !GPLIB_PCB:MOUNTHOLE
Q7 = !GPLIB_ACTIVE:NPN; JLCPCB: C2146
R1 R48 = !GPLIB_PASSIVE:RES_0402; JLCPCB: C25879; JLC_PARTS_TYPE: Basic
R2 = !GPLIB_PASSIVE:RES_0402; JLCPCB: C25879; JLC_PARTS_TYPE: Basic; MF: UNI-ROYAL(Uniroyal Elec); MP: 0402WGF2201TCE
R5 = !GPLIB_PASSIVE:RES_0402; JLCPCB: C2909311; MF: FOJAN; MP: FRC0402F1103TS
R6 R32 R33 R36 R37 = !GPLIB_PASSIVE:RES_0402; JLCPCB: C25092; JLC_PARTS_TYPE: Basic; MF: UNI-ROYAL(Uniroyal Elec); MP: 0402WGF220JTCE
R8 = !GPLIB_PASSIVE:RES_0402; JLCPCB: C2909314; MF: FOJAN; MP: FRC0402F1203TS
R9 R12 R21 R56 = !GPLIB_PASSIVE:RES_0402; JLCPCB: C2906861; MF: FOJAN; MP: FRC0402F1002TS
R10 R29 = !GPLIB_PASSIVE:RES_0402; JLCPCB: C25741; JLC_PARTS_TYPE: Basic; MF: UNI-ROYAL(Uniroyal Elec); MP: 0402WGF1003TCE
R11 = !GPLIB_PASSIVE:RES_0402; JLCPCB: C324800; MF: FH (Guangdong Fenghua Advanced Tech); MP: RC-02K4021FT
R13-R20 = !GPLIB_PASSIVE:RES_0201; JLCPCB: C102714; MF: UNI-ROYAL(Uniroyal Elec); MP: 0201WMJ022JTEE
R22 R66 = !GPLIB_PASSIVE:RES_0402; JLCPCB: C26083; JLC_PARTS_TYPE: Basic; MF: UNI-ROYAL(Uniroyal Elec); MP: 0402WGF1004TCE
R23 = !GPLIB_PASSIVE:RES_0402; JLCPCB: C105871; MF: YAGEO; MP: RC0402FR-074K7L
R24 R30 R31 R35 = !GPLIB_PASSIVE:RES_0402; JLCPCB: C25076; JLC_PARTS_TYPE: Basic; MF: UNI-ROYAL(Uniroyal Elec); MP: 0402WGF1000TCE
R25 = !GPLIB_PASSIVE:RES_0402; JLCPCB: C138022; MF: YAGEO; MP: RC0402FR-0727KL
R26 R27 = !GPLIB_PASSIVE:RES_0402; JLCPCB: C2909310; MF: FOJAN; MP: FRC0402F1801TS
R28 = !GPLIB_PASSIVE:RES_0402; JLCPCB: C106235; MF: YAGEO; MP: RC0402FR-071KL
R34 = !GPLIB_PASSIVE:RES_0402; JLCPCB: C4109; JLC_PARTS_TYPE: Basic; MF: UNI-ROYAL(Uniroyal Elec); MP: 0402WGF2001TCE
R40-R43 = !GPLIB_PASSIVE:RES_0402; JLCPCB: C25105; JLC_PARTS_TYPE: Basic; MF: UNI-ROYAL(Uniroyal Elec); MP: 0402WGF330JTCE
R58 = !GPLIB_PASSIVE:RES_0402; JLCPCB: C25794; JLC_PARTS_TYPE: Basic; MF: UNI-ROYAL(Uniroyal Elec); MP: 0402WGF5102TCE
TP1-TP15 = !GPLIB_PCB:TESTPOINT
U2 = groundplane:SY8089A1AAC; JLC-ROTATION: 180; JLC-X-OFFSET: 0; JLC-Y-OFFSET: 0; JLCPCB: C479074; MF: Silergy Corp; MP: SY8089A1AAC
U3 = !GPLIB_ACTIVE:IF_VIDEO_BRIDGE_RK628F/H; JLCPCB: C45369093; MF: Rockchip; MP: RK628H
U4 U5 = !GPLIB_ACTIVE:TVS_ESD_4CH_10P_PASS_THRU: ESD and Surge protection diodes TVS 4 line bi-directional DFN2510-10; JLCPCB: C42375217; JLC_FOOTPRINT: TRUE; MF: KUU; MP: BTRD10A03
Y5 = groundplane:CRYSTAL_SMD2016-4P; JLCPCB: C20885025; MF: Yajingxin; MP: T201624MLBDE2X

## Net classes
4 hdmi_diff: width 0.113 mm

## Board
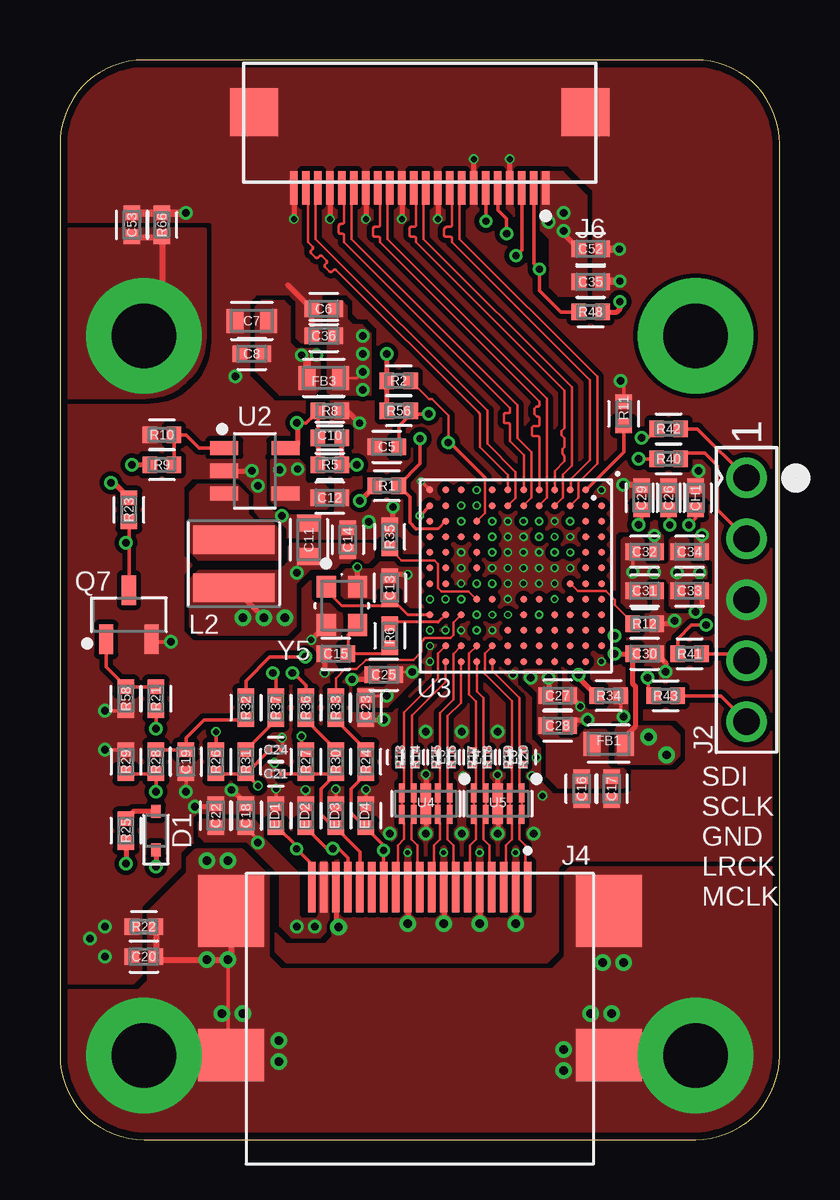
[diagram p6: board, top side]
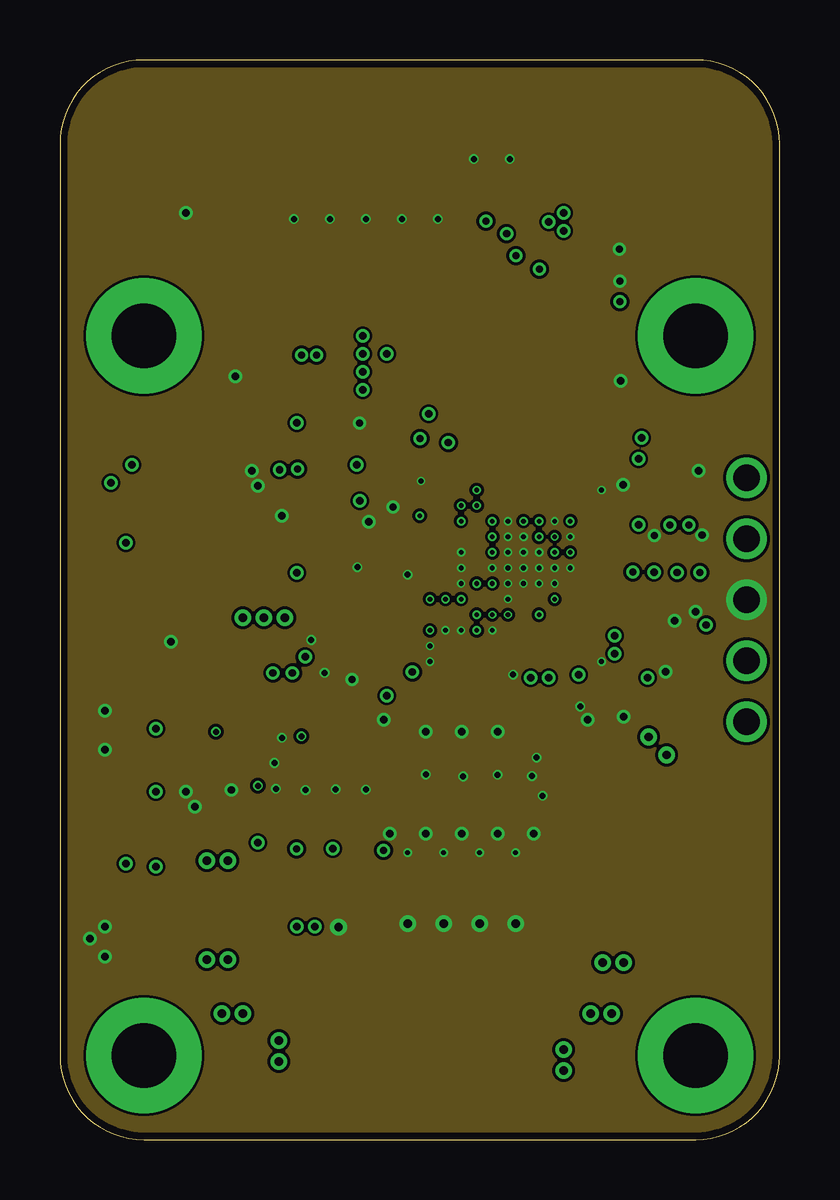
[diagram p7: board, inner layer Route2]
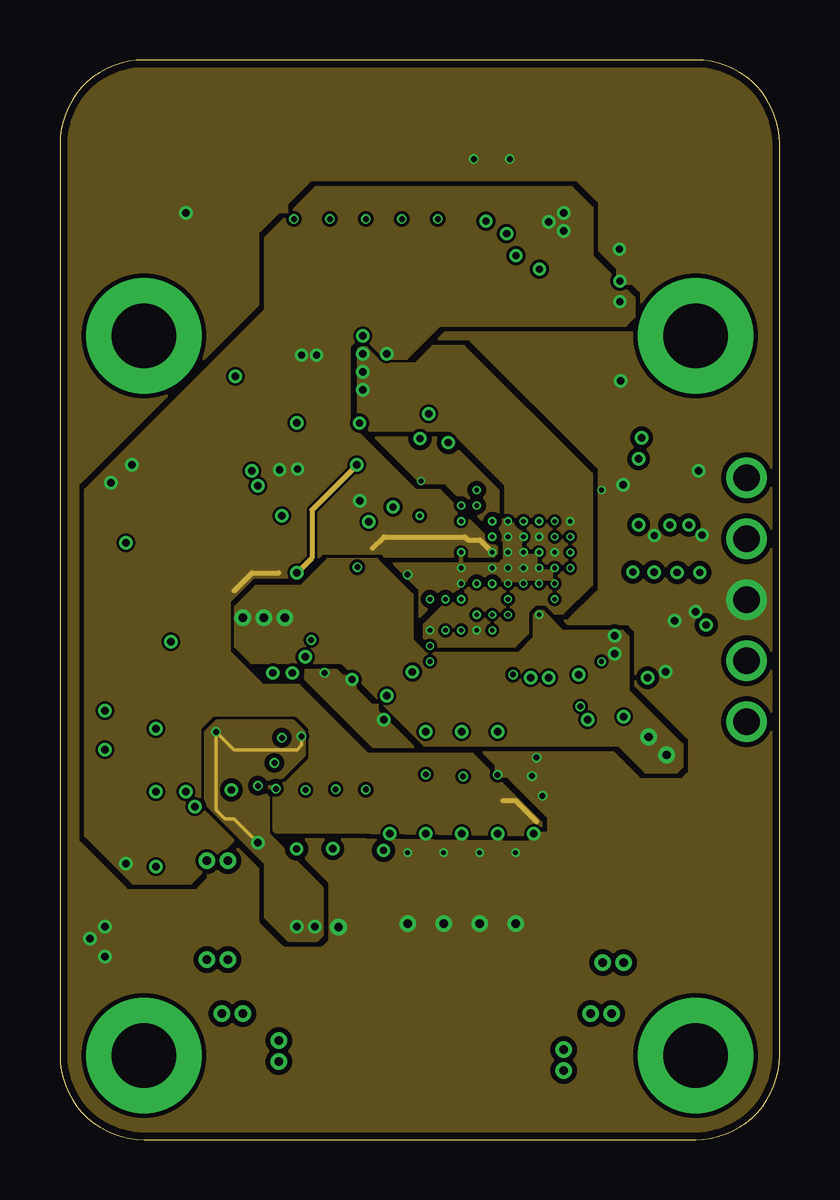
[diagram p8: board, inner layer Route15]
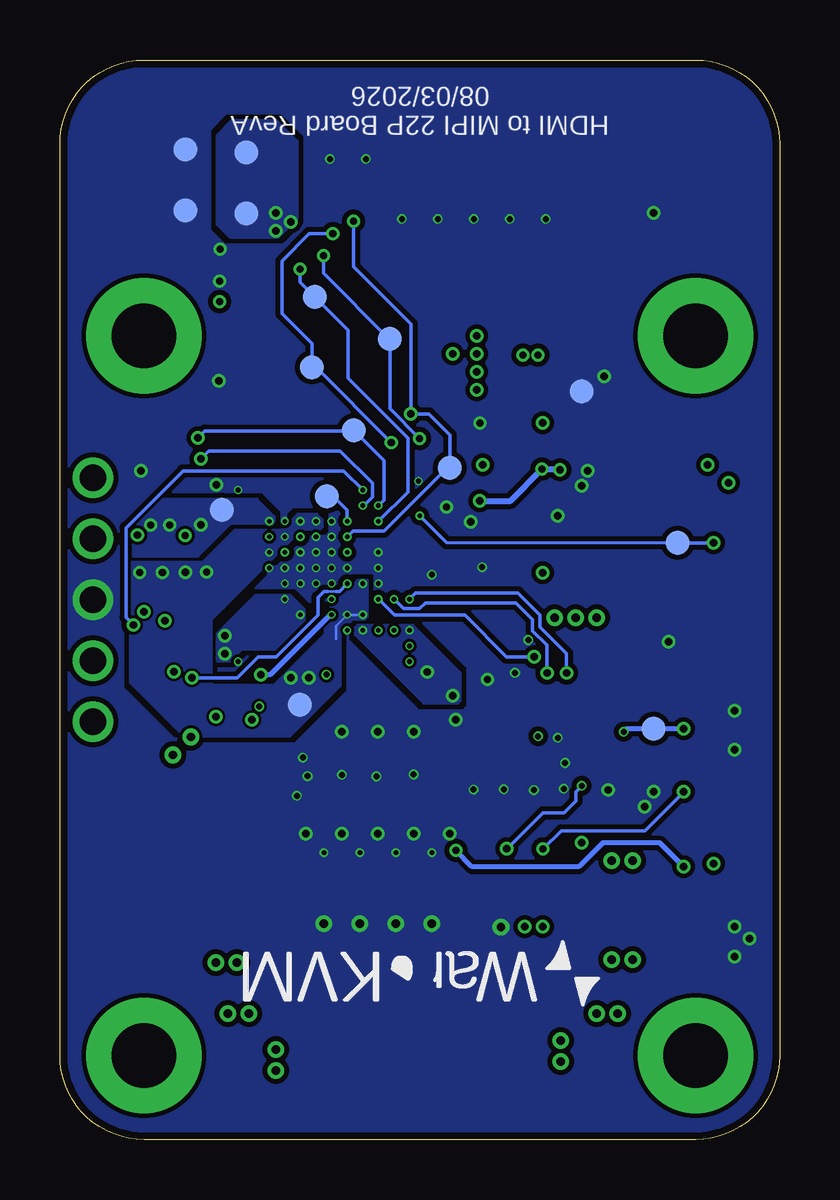
[diagram p9: board, bottom side, seen from below]

Size 30 x 45 mm. Coordinates in mm from the lower left corner, seen from the top.
Outline: 0,41.5 0,3.5 arc90 3.5,0 26.5,0 arc90 30,3.5 30,41.5 arc90 26.5,45 3.5,45 arc90 0,41.5
Copper layers (1+2*15+16): Top 0.035mm / dielectric 1.5mm / Route2 0.035mm / dielectric 0.15mm / Route15 0.035mm / dielectric 0.2mm / Bottom 0.035mm
Design rules "Fusion Electronics Design Rules *": minimum track width 0.1mm, minimum drill 0.2mm, track to track 0.12mm, track to pad 0.1mm, pad to pad 0.12mm, via to via 0.12mm, smd to smd 0.14mm, copper to edge 0.3mm, drill to drill 6mil, minimum pad ring 0mil, minimum via ring 0mil, stop-mask expansion 0mil, vias tented up to drill 9999mil, thermal gap 10mil

### Footprints (pad centres in the part's own frame; a part is rotated, then mirrored left to right if it is on the bottom)
CAP_0402 = smd 0.6 x 0.7: 1 -0.5,0; 2 0.5,0
CAP_0603 = smd 0.7 x 1: 1 -0.7,0; 2 0.7,0
CAP_0201 = smd 0.25 x 0.35: 1 -0.275,0; 2 0.275,0
SD103AX = smd 0.54 x 0.404: A 0.796,0; C -0.796,0
TVS_0402 = smd 0.6 x 0.7: 1 -0.5,0; 2 0.5,0
IND_0603 = smd 0.7 x 1: 1 -0.7,0; 2 0.7,0
HDR_1X05_2.54MM_TH_ST = drill 1.1 pad 1.7: 1 -5.08,0; 2 -2.54,0; 3 0,0; 4 2.54,0; 5 5.08,0
CONN_HDMI_A_SMT_RA_HC-HDMI0019T-4 = smd 0.3 x 2.1: 1 4.5,6.4; 2 4,6.4; 3 3.5,6.4; 4 3,6.4; 5 2.5,6.4; 6 2,6.4; 7 1.5,6.4; 8 1,6.4; 9 0.5,6.4; 10 0,6.4; 11 -0.5,6.4; 12 -1,6.4; 13 -1.5,6.4; 14 -2,6.4; 15 -2.5,6.4; 16 -3,6.4; 17 -3.5,6.4; 18 -4,6.4; 19 -4.5,6.4 | smd 2.75 x 2.2: 20 -7.875,-0.6; 21 7.875,-0.6 | smd 2.75 x 3: 22 -7.875,5.4; 23 7.875,5.4
CONN_FFC_1X22_0.5MM_SM_RA_0.5K-GX-22PWB-R = smd 0.3 x 1.4: 1 -5.25,1.575; 2 -4.75,1.575; 3 -4.25,1.575; 4 -3.75,1.575; 5 -3.25,1.575; 6 -2.75,1.575; 7 -2.25,1.575; 8 -1.75,1.575; 9 -1.25,1.575; 10 -0.75,1.575; 11 -0.25,1.575; 12 0.25,1.575; 13 0.75,1.575; 14 1.25,1.575; 15 1.75,1.575; 16 2.25,1.575; 17 2.75,1.575; 18 3.25,1.575; 19 3.75,1.575; 20 4.25,1.575; 21 4.75,1.575; 22 5.25,1.575 | smd 2 x 2: 23 -6.9,-1.575; 24 6.9,-1.575
IND_3MM_SQ_1.2MM_HEIGHT = smd 1.2 x 3.4: 1 -1,0; 2 1,0
BCMF062P120T = smd 0.25 x 0.35: 1 -0.275,0.3; 2 -0.275,-0.3; 3 0.275,-0.3; 4 0.275,0.3
MOUNTHOLE_M2.5_4.8MM_PAD = drill 2.7 pad 4.8: P$1 0,0
SOT-23-3 = smd 1.229 x 0.592: 1 1.022,-0.95; 2 1.022,0.95; 3 -1.022,0
RES_0402 = smd 0.6 x 0.7: 1 -0.5,0; 2 0.5,0
RES_0201 = smd 0.25 x 0.35: 1 -0.275,0; 2 0.275,0
TEST_POINT_1MM = smd 1 x 1: P$1 0,0
SOT95P285X110-5N = smd 1.172 x 0.592: 1 -1.275,0.95; 2 -1.275,0; 3 -1.275,-0.95; 4 1.275,-0.95; 5 1.275,0.95
WBBGA144_8X8MM = smd 0.3 x 0.3: A1 -3.575,3.575; A2 -2.925,3.575; A3 -2.275,3.575; A4 -1.625,3.575; A5 -0.975,3.575; A6 -0.325,3.575; A7 0.325,3.575; A8 0.975,3.575; A9 1.625,3.575; A10 2.275,3.575; A11 2.925,3.575; A12 3.575,3.575; B1 -3.575,2.925; B2 -2.925,2.925; B3 -2.275,2.925; B4 -1.625,2.925; B5 -0.975,2.925; B6 -0.325,2.925; B7 0.325,2.925; B8 0.975,2.925; B9 1.625,2.925; B10 2.275,2.925; B11 2.925,2.925; B12 3.575,2.925; C1 -3.575,2.275; C2 -2.925,2.275; C3 -2.275,2.275; C4 -1.625,2.275; C5 -0.975,2.275; C6 -0.325,2.275; C7 0.325,2.275; C8 0.975,2.275; C9 1.625,2.275; C10 2.275,2.275; C11 2.925,2.275; C12 3.575,2.275; D1 -3.575,1.625; D2 -2.925,1.625; D3 -2.275,1.625; D4 -1.625,1.625; D5 -0.975,1.625; D6 -0.325,1.625; D7 0.325,1.625; D8 0.975,1.625; D9 1.625,1.625; D10 2.275,1.625; D11 2.925,1.625; D12 3.575,1.625; E1 -3.575,0.975; E2 -2.925,0.975; E3 -2.275,0.975; E4 -1.625,0.975; E5 -0.975,0.975; E6 -0.325,0.975; E7 0.325,0.975; E8 0.975,0.975; E9 1.625,0.975; E10 2.275,0.975; E11 2.925,0.975; E12 3.575,0.975; F1 -3.575,0.325; F2 -2.925,0.325; F3 -2.275,0.325; F4 -1.625,0.325; F5 -0.975,0.325; F6 -0.325,0.325; F7 0.325,0.325; F8 0.975,0.325; F9 1.625,0.325; F10 2.275,0.325; F11 2.925,0.325; F12 3.575,0.325; G1 -3.575,-0.325; G2 -2.925,-0.325; G3 -2.275,-0.325; G4 -1.625,-0.325; G5 -0.975,-0.325; G6 -0.325,-0.325; G7 0.325,-0.325; G8 0.975,-0.325; G9 1.625,-0.325; G10 2.275,-0.325; G11 2.925,-0.325; G12 3.575,-0.325; H1 -3.575,-0.975; H2 -2.925,-0.975; H3 -2.275,-0.975; H4 -1.625,-0.975; H5 -0.975,-0.975; H6 -0.325,-0.975; H7 0.325,-0.975; H8 0.975,-0.975; H9 1.625,-0.975; H10 2.275,-0.975; H11 2.925,-0.975; H12 3.575,-0.975; J1 -3.575,-1.625; J2 -2.925,-1.625; J3 -2.275,-1.625; J4 -1.625,-1.625; J5 -0.975,-1.625; J6 -0.325,-1.625; J7 0.325,-1.625; J8 0.975,-1.625; J9 1.625,-1.625; J10 2.275,-1.625; J11 2.925,-1.625; J12 3.575,-1.625; K1 -3.575,-2.275; K2 -2.925,-2.275; K3 -2.275,-2.275; K4 -1.625,-2.275; K5 -0.975,-2.275; K6 -0.325,-2.275; K7 0.325,-2.275; K8 0.975,-2.275; K9 1.625,-2.275; K10 2.275,-2.275; K11 2.925,-2.275; K12 3.575,-2.275; L1 -3.575,-2.925; L2 -2.925,-2.925; L3 -2.275,-2.925; L4 -1.625,-2.925; L5 -0.975,-2.925; L6 -0.325,-2.925; L7 0.325,-2.925; L8 0.975,-2.925; L9 1.625,-2.925; L10 2.275,-2.925; L11 2.925,-2.925; L12 3.575,-2.925; M1 -3.575,-3.575; M2 -2.925,-3.575; M3 -2.275,-3.575; M4 -1.625,-3.575; M5 -0.975,-3.575; M6 -0.325,-3.575; M7 0.325,-3.575; M8 0.975,-3.575; M9 1.625,-3.575; M10 2.275,-3.575; M11 2.925,-3.575; M12 3.575,-3.575
DFN2510-10 = smd 0.224 x 0.793: 1 -1,-0.455; 2 -0.5,-0.455; 4 0.5,-0.455; 5 1,-0.455; 6 1,0.455; 7 0.5,0.455; 9 -0.5,0.455; 10 -1,0.455 | smd 0.424 x 0.793: 3 0,-0.455; 8 0,0.455
CRYSTAL_SMD2016-4P = smd 0.9 x 0.8: 1 -0.8,-0.65; 2 0.8,-0.65; 3 0.8,0.65; 4 -0.8,0.65

### Placement (x,y rotation side)
C5  13.62,28.88 0 top
C6  11,34.62 0 top
C7  8,34.12 0 top
C8  8,32.75 0 top
C10  11.25,29.25 0 top
C11  10.38,25 270 top
C12  11.25,26.75 180 top
C13  13.75,23 270 top
C14  12,25 270 top
C15  11.5,20.25 0 top
C16  21.75,14.62 90 top
C17  23,14.62 90 top
C18  7.75,13.5 270 top
C19  5.25,15.75 90 top
C20  3.5,7.62 0 top
C21  9,15.25 0 top
C22  6.5,13.5 270 top
C23  12.75,18 90 top
C24  9,16.25 180 top
C25  13.5,19.38 0 top
C26  25.38,26.75 270 top
C27  20.75,18.5 180 top
C28  20.75,17.25 180 top
C29  24.25,26.75 270 top
C30  24.38,20.25 0 top
C31  24.38,22.88 180 top
C32  24.38,24.5 180 top
C33  26.25,22.88 180 top
C34  26.25,24.5 180 top
C35  22.12,35.75 0 top
C36  11,33.5 0 top
C52  22.12,37.12 0 top
C53  3,38.12 270 top
CH1  26.5,26.75 270 top
D1  4,12.88 90 top
ED1  9,13.5 270 top
ED2  10.25,13.5 270 top
ED3  11.5,13.5 270 top
ED4  12.75,13.5 270 top
FB1  22.88,16.5 180 top
FB3  11,31.75 0 top
J2  28.62,22.5 270 top
J4  15,4.12 0 top
J6  15,41.25 180 top
L2  7.25,24 270 top
L3  14.5,15.94 270 top
L4  16,15.94 270 top
L5  17.5,15.94 270 top
L6  19,15.94 270 top
MNT1  3.5,33.5 0 top
MNT2  26.5,33.5 0 top
MNT3  26.5,3.5 0 top
MNT4  3.5,3.5 0 top
Q7  2.88,21.88 270 top
R1  13.62,27.25 180 top
R2  14.12,31.62 180 top
R5  11.25,28.12 180 top
R6  13.75,21 270 top
R8  11.25,30.38 0 top
R9  4.25,28.12 180 top
R10  4.25,29.38 180 top
R11  23.5,30.25 270 top
R12  24.38,21.5 180 top
R13  14.19,15.94 90 top
R14  14.81,15.94 90 top
R15  15.69,15.94 90 top
R16  16.31,15.94 90 top
R17  17.19,15.94 90 top
R18  17.81,15.94 90 top
R19  18.69,15.94 90 top
R20  19.31,15.94 90 top
R21  4,18.38 270 top
R22  3.5,8.88 180 top
R23  2.88,26.25 90 top
R24  12.75,15.75 90 top
R25  2.75,12.88 270 top
R26  6.5,15.75 270 top
R27  10.25,15.75 270 top
R28  4,15.75 90 top
R29  2.75,15.75 270 top
R30  11.5,15.75 90 top
R31  7.75,15.75 90 top
R32  7.75,18 270 top
R33  11.5,18 270 top
R34  22.88,18.5 180 top
R35  13.75,25.12 90 top
R36  10.25,18 270 top
R37  9,18 270 top
R40  25.38,28.38 0 top
R41  26.25,20.25 0 top
R42  25.38,29.62 0 top
R43  25.25,18.5 0 top
R48  22.12,34.5 0 top
R56  14.12,30.38 180 top
R58  2.75,18.38 90 top
R66  4.25,38.12 90 top
TP1  8.25,31.19 180 bottom
TP2  17.75,29.56 180 bottom
TP3  18.88,26.81 180 bottom
TP4  19.5,32.19 180 bottom
TP5  23.25,26.25 0 bottom
TP6  20,18.12 0 bottom
TP7  22.23,41.15 0 bottom
TP8  22.23,38.61 0 bottom
TP9  24.77,41.27 0 bottom
TP10  24.77,38.73 0 bottom
TP11  13.75,28 0 bottom
TP12  19.38,35.12 180 bottom
TP13  16.25,33.38 180 bottom
TP14  5.25,17.12 180 bottom
TP15  4.25,24.88 180 bottom
U2  8.12,27.88 0 top
U3  19,23.5 270 top
U4  15.25,14 180 top
U5  18.25,14 180 top
Y5  11.75,22.25 270 top

### Tracks (layer width: path | path; a pad name or v marks a point on that pad's centre or on a via)
CGND  (via drill 0.35 pad 0.7)
  Top 0.152: J4.20 7.12,4.25 | J4.20 3.52,3.52 MNT4.P$1 | J4.20 7,3.65 v7,7.5
  Top 0.254: R22.1 C20.2 4.12,7.5 v6.12,7.5 v7,7.5 7.12,7.62 J4.22
  other vias: 6.12,11.62 7,11.62 21,2.88 21,3.75 22.62,7.38 23.5,7.38 22.12,5.25 23,5.25 6.75,5.25 7.62,5.25 9.12,4.12 9.12,3.25
  pour Top (no thermals): 3.7,6.56 3.31,6.16 3.27,6.15 -0.9,6.15 -0.9,0.1 30.15,0.1 30.15,11.27 21.29,11.27 21.1,11.08 21.1,7.6 21.09,7.57 20.56,7.04 20.52,7.02 9.23,7.02 9.19,7.04 8.66,7.57 8.65,7.6 8.65,10.96 7.58,12.02 5.67,12.02 5.35,11.71 5.35,11.1 5.34,11.07 3.72,9.45 3.72,6.6
GND  (via drill 0.2 pad 0.33, 0.2 pad 0.34, 0.2 pad 0.35, 0.25 pad 0.4, 0.3 pad 0.55, 0.35 pad 0.7)
  Top 0.113: R35.2 13.88,25.76
  Top 0.152: v23.38,31.62 23.5,31.5 R11.1 | U3.M1 v15.05,27.45 | v12.75,14.58 ED4.1 | ED3.1 v11.5,14.59 v11.49,14.6 | v10.24,14.57 ED2.1 | ED1.1 v9,14.62 | C24.1 9.28,16.73 v9.25,16.75 | C21.1 8.94,15.46 v8.94,15.7 | Q7.2 3.93,20.75 v4.62,20.75 | R29.1 v1.88,16.25 | R58.1 v1.88,17.88 | C19.1 v5.25,14.5 | R34.1 23.38,17.75 v23.5,17.62
  Top 0.203: J4.5 v17.5,9 | J4.2 v19,9 | J4.8 v16,9 | J4.11 v14.5,9 | v18.25,12.75 U5.8 U5.3 v18.24,15.21 | v15.25,12.75 U4.8 U4.3 v15.25,15.22 | C15.1 11.03,20.22 v11.03,19.45 | Y5.2 v10.48,20.83 v10.48,20.82 | Y5.4 v12.4,23.85 v12.4,23.86 | v14.49,23.55 13.79,23.55 C13.1 | v11.61,8.85 11.5,8.97 J4.17 | U2.2 v8,27.88 | v12.49,29.86 11.98,30.38 R8.2 | C36.1 C6.1 9.5,35.62 | 13.88,25.76 v13.88,26.36 | C28.1 21.5,17.5 v22,17.5 | v21.7,18.05 C27.1 | v24.79,25.18 24.79,24.59 C32.1 | v25.62,21.62 25.5,21.5 R12.1 | C33.1 26.75,22.25 v26.5,22 | C30.2 25.25,19.88 v25.25,19.5 | v26.77,25.2 26.77,24.52 C34.1 | C25.1 12.8,19.17 v12.17,19.17 | C23.1 v13.5,17.5 | C22.1 6.38,13.88 v5.62,13.88 | C18.1 7.17,14.58 v7.14,14.58 | J6.16 v12.75,38.38 | J6.19 v11.25,38.38 | J6.13 v14.25,38.38 | J6.10 v15.75,38.38 | J6.22 v9.75,38.38 | J6.7 v17.25,40.88 | J6.4 v18.75,40.88
  Top 0.254: C29.1 24.21,27.29 v23.48,27.29 | CH1.1 26.62,27.38 v26.62,27.88
  Top 0.305: v23.35,35.78 22.66,35.78 C35.2 | v23.33,37.12 C52.2 | C53.1 R66.2 v5.25,38.62
  other vias: 16.07,21.23 15.43,20.57 15.43,19.93 16.73,21.23 22.57,19.93 18.02,21.23 16.73,23.18 16.73,23.82 16.73,24.48 18.02,23.82 18.68,23.18 18.68,22.52 19.32,23.18 19.98,23.18 20.62,23.18 18.68,23.82 18.68,24.48 18.68,25.12 19.32,25.12 19.32,24.48 19.98,24.48 19.32,23.82 19.98,23.82 20.62,23.82 21.27,23.82 21.27,25.12 20.62,25.77 18.68,25.77 7.31,31.81 8.25,27.25 9.25,26 12.88,25.75 22.57,27.07 16.81,15.13 19.87,15.92 19.68,15.15 20.12,14.33 16.75,12.75 15.25,17 16.75,17 18.25,17 18.89,19.38 18.99,11.96 17.49,11.96 15.99,11.96 14.49,11.96 19.75,12.75 13.75,12.75 1.88,8.88 1.88,7.62 1.25,8.38
  pour Route2 (no thermals): -0.69,-0.19 30.19,-0.19 30.19,45.19 -0.69,45.19
  pour Top (no thermals): 8.17,26.16 8.35,25.97 8.99,25.97 9.02,25.96 9.91,25.08 13.17,25.08 13.17,26.05 11.91,26.05 11.67,25.81 11.64,25.8 9.23,25.8 9.21,25.81 8.56,26.46 8.55,26.48 8.55,28.3 5.95,28.3 5.95,27.62 7.43,27.62 7.46,27.61 8.16,26.91 8.17,26.88
  pour Top (isolate 0.203, rank 6, no thermals): -0.69,-0.19 30.19,-0.19 30.19,45.19 -0.69,45.19
  pour Bottom (isolate 0.203, rank 6, no thermals): -0.6,-0.15 30.28,-0.15 30.28,45.24 -0.6,45.24
  pour Route15 (isolate 0.203, rank 6, no thermals): -0.69,-0.19 30.19,-0.19 30.19,45.19 -0.69,45.19
HDMI_1-CEC  (via drill 0.3 pad 0.55)
  Top 0.152: J4.13 v13.5,12.05 13.5,12.25 ED4.2 12.12,13.62 12.12,14.62 R24.1
  Top 0.203: D1.C v4,11.38
  Bottom 0.203: v4,11.38 5,12.38 7.38,12.38 8.38,11.38 12.82,11.38 v13.5,12.05
HDMI_1-HPD  (via drill 0.3 pad 0.55)
  Top 0.152: J4.19 10.5,11.47 v9.86,12.11 9.86,12.23 9.09,13 ED1.2 | R29.2 R28.1 v4,14.5
  Bottom 0.152: v4,14.5 5.62,12.88 9.09,12.88 v9.86,12.11
HDMI_1-SCL
  Top 0.152: J4.15 12.5,12 ED3.2 11.42,13 10.88,13.55 10.88,14.62 11.44,15.19 | R30.1 11.44,15.19 | 11.44,15.19 11.38,15.25 R27.2 C21.2
HDMI_1-SDA  (via drill 0.25 pad 0.4, 0.3 pad 0.55)
  Top 0.152: J4.16 12,11.75 11.62,12.12 v11.38,12.12 11.12,12.12 ED2.2 | R31.1 8.72,16.23 C24.2 | R26.2 R31.1 | R31.1 v8.25,14.75
  Bottom 0.152: v8.25,14.75 8.5,14.5 8.5,14.12 9,13.62 9.88,13.62 v11.38,12.12
HDMIRX_CEC
  Top 0.143: R33.2 R24.2
HDMIRX_DETN  (via drill 0.2 pad 0.35, 0.3 pad 0.55)
  Top 0.152: U3.M2 v15,26 | Q7.3 2.88,24.75 v2.75,24.88 2.88,25 R23.1
  Bottom 0.152: v15,26 13.88,24.88 3.5,24.88 | 3.5,24.88 v2.75,24.88 | v2.75,24.88 | 3.5,24.88 | 3.5,24.88 TP15.P$1
HDMIRX_HPD
  Top 0.152: R28.2 C19.2 5.25,16.75 6,17.5 R32.2
HDMIRX_SCL
  Top 0.143: R30.2 R36.2
HDMIRX_SDA
  Top 0.143: R37.2 R31.2
HRX0_1_N
  Top 0.113: J4.9 15.57,10.85 15.59,10.69 15.59,12.27 15.84,12.52 15.84,13.21 15.75,13.29 U4.9 U4.2 15.84,14.54 15.84,15.52 L4.3
HRX0_1_P
  Top 0.113: J4.7 16.41,10.94 16.41,12.25 16.16,12.5 16.16,13.46 U4.10 U4.1 16.16,14.54 16.16,15.52 L4.4
HRX0_N
  Top 0.113: U3.K11 16.4,20.25 16.4,18.33 15.85,17.79 15.85,16.32 15.74,16.21 L4.2
HRX0_P
  Top 0.113: U3.K12 16.71,19.91 16.71,18.2 16.16,17.66 16.16,16.32 16.28,16.21 R16.2
HRX1_1_N
  Top 0.113: J4.6 17.09,10.94 17.09,12.27 17.34,12.52 17.34,13.45 U5.6 U5.5 17.34,14.54 17.34,15.52 L5.3
HRX1_1_P
  Top 0.113: J4.4 17.91,10.94 17.91,12.25 17.66,12.5 17.66,13.45 U5.7 U5.4 17.66,14.54 17.66,15.52 L5.4
HRX1_N
  Top 0.113: U3.J11 17.06,20.26 17.06,18.55 17.34,18.27 17.34,16.35 L5.2
HRX1_P
  Top 0.113: U3.J12 17.38,18.69 17.66,18.4 17.66,16.32 17.76,16.21 L5.1
HRX2_1_N
  Top 0.113: J4.3 18.6,10.94 18.6,12.27 18.84,12.52 18.84,13.45 U5.9 U5.2 18.84,14.54 18.84,15.51 R19.1
HRX2_1_P
  Top 0.113: J4.1 19.41,10.94 19.41,12.26 19.16,12.5 19.16,13.45 U5.10 U5.1 19.16,14.54 19.16,15.52 L6.4
HRX2_N
  Top 0.113: U3.H11 17.71,20.26 17.71,19.41 18.84,18.28 18.84,16.32 18.72,16.21 R19.2
HRX2_P
  Top 0.113: U3.H12 18.03,19.54 19.15,18.41 19.15,16.32 19.26,16.21 L6.1
HRXC_1_N
  Top 0.113: J4.12 14.07,10.85 14.09,10.68 14.09,12.27 14.34,12.53 14.34,13.21 14.25,13.29 U4.6 U4.5 14.34,14.54 14.34,15.52 L3.3
HRXC_1_P
  Top 0.113: J4.10 14.91,11.02 14.91,12.27 14.66,12.52 14.66,13.21 14.75,13.29 U4.7 U4.4 14.66,14.54 14.66,15.52 L3.4
HRXC_N
  Top 0.113: U3.L11 15.76,20.26 15.76,19.21 14.35,17.8 14.35,16.32 14.24,16.21 L3.2
HRXC_P
  Top 0.113: U3.L12 16.07,19.91 16.07,19.07 14.68,17.67 14.68,16.32 14.79,16.21 R14.2
I2C_SCL_3V3  (via drill 0.3 pad 0.55)
  Top 0.127: U3.L3 15.76,25.45 14.85,25.45
  Top 0.152: 14.85,25.45 14.59,25.71 14.59,26.79 R1.1 14.12,27.29 15.01,28.17 v15.01,29.22 | J6.3 19.25,37.08 v19.01,36.84
  Bottom 0.152: v19.01,36.84 19.01,36.11 16.27,33.38 TP13.P$1 16.25,30.47 v15.01,29.22
I2C_SDA_3V3  (via drill 0.2 pad 0.35, 0.3 pad 0.55)
  Top 0.152: J6.2 19.75,36.51 v19.98,36.28 19.98,35.39 20.88,34.5 R48.1
  Bottom 0.152: U3.K3 15.5,27 15.5,29.25 18,31.75 18,33.75 TP12.P$1 19.98,35.73 v19.98,36.28
  other vias: 16.73,25.77
I2S_HDMI_LRCK
  Top 0.143: R41.2 28.34,20.25 J2.4
I2S_HDMI_MCLK
  Top 0.143: R43.2 27.25,18.5 27.38,18.5 27.55,18.5 J2.5
I2S_HDMI_SCLK
  Top 0.143: R40.2 26.12,28.62 26.88,28.62 27.41,28.09 27.41,26.26 J2.2
I2S_HDMI_SDI
  Top 0.143: J2.1 26.58,29.62 R42.2
MIPI-CSI0-CK_N
  Top 0.113: J6.15 13.25,39.15 13.34,39.06 13.34,38.12 arc-90 13.26,38.04 13.14,38.04 arc90 13.06,37.96 13.06,37.71 arc90 13.14,37.63 13.26,37.63 arc-90 13.34,37.55 13.34,37.41 19.99,30.76 19.99,30.63 arc-90 19.91,30.56 19.86,30.56 19.79,30.48 19.79,30.24 19.89,30.14 19.91,30.14 arc-90 19.99,30.07 19.99,29.81 arc-90 19.91,29.73 19.73,29.73 19.67,29.67 19.67,29.37 19.72,29.32 19.91,29.32 arc-90 19.99,29.24 19.99,27.09 U3.E1
MIPI-CSI0-CK_P
  Top 0.113: J6.14 13.75,39.15 13.66,39.06 13.66,37.54 20.3,30.89 20.3,26.75 U3.E2
MIPI-CSI0-D0_N
  Top 0.113: J6.21 10.25,39.15 10.34,39.06 10.34,37.41 10.52,37.23 arc-90 10.52,37.12 10.47,37.06 arc90 10.47,36.95 10.65,36.77 arc90 10.76,36.77 10.82,36.82 arc-90 10.93,36.82 11.11,36.64 arc-90 11.11,36.53 11.06,36.48 arc90 11.06,36.37 11.23,36.19 arc90 11.35,36.19 11.4,36.24 arc-90 11.51,36.24 17.44,30.31 17.5,30.25 17.5,28.87 18.68,27.7 U3.G1
MIPI-CSI0-D0_P
  Top 0.113: U3.G2 19,26.75 19,27.83 17.82,29 17.82,30.38 10.66,37.54 10.66,39.06 10.75,39.15 J6.20
MIPI-CSI0-D1_N
  Top 0.113: U3.F1 19.35,27.1 19.35,28.53 18.77,29.11 18.77,29.78 arc90 18.69,29.86 18.58,29.86 arc-90 18.5,29.94 18.5,30.2 arc-90 18.58,30.28 18.69,30.28 arc90 18.77,30.36 18.77,30.48 11.84,37.41 11.84,37.68 arc90 11.76,37.76 11.7,37.76 arc-90 11.62,37.84 11.62,38.06 arc-90 11.73,38.17 11.76,38.17 arc90 11.84,38.25 11.84,39.06 11.75,39.15 J6.18
MIPI-CSI0-D1_P
  Top 0.113: U3.F2 19.66,26.76 19.66,28.66 19.08,29.24 19.08,30.61 12.16,37.54 12.16,39.06 12.25,39.15 J6.17
MIPI-CSI0-D2_N
  Top 0.113: J6.12 14.75,39.15 14.84,39.06 14.84,38.12 arc-90 14.76,38.04 14.65,38.04 arc90 14.57,37.96 14.57,37.71 arc90 14.65,37.63 14.76,37.63 arc-90 14.84,37.55 14.84,37.41 21.03,31.22 21.03,29.65 20.9,29.53 20.9,29.37 21.03,29.25 21.03,28.88 20.94,28.79 20.94,28.59 21.03,28.5 21.03,28.28 20.62,27.88 U3.D1
MIPI-CSI0-D2_P
  Top 0.113: U3.D2 20.96,26.76 20.96,27.71 21.34,28.09 21.34,31.36 15.16,37.54 15.16,39.06 15.25,39.15 J6.11
MIPI-CSI0-D3_N
  Top 0.113: U3.C1 21.29,27.09 21.29,27.52 22.09,28.32 22.09,31.66 16.34,37.41 16.34,37.55 arc90 16.26,37.63 16.09,37.63 arc-90 16.01,37.71 16.01,37.92 arc-90 16.14,38.04 16.26,38.04 arc90 16.34,38.12 16.34,39.06 16.25,39.15 J6.9
MIPI-CSI0-D3_P
  Top 0.113: U3.C2 21.61,26.76 21.61,27.39 22.4,28.18 22.4,31.79 16.66,37.54 16.66,39.06 16.75,39.15 J6.8
N$2
  Top 0.127: R6.2 13.5,20.25 C15.2 12,21.05 Y5.3
N$11
  Top 0.203: D1.A 3.05,13.67 R25.1
N$15  (via drill 0.2 pad 0.35, 0.3 pad 0.55)
  Top 0.143: R40.1 v24.12,28.38
  Bottom 0.143: U3.J2 17.32,26.43 16.97,26.78 16.97,27.36 18.31,28.71 23.79,28.71 v24.12,28.38
  other vias: 17.38,26.43
N$16  (via drill 0.2 pad 0.35, 0.3 pad 0.55)
  Top 0.143: v26.94,21.45 26.33,21.45 25.75,20.88 R41.1
  Bottom 0.143: U3.J1 18.18,27.88 24.88,27.88 27.25,25.5 27.25,21.76 v26.94,21.45
  other vias: 17.38,27.07
N$18  (via drill 0.2 pad 0.35, 0.3 pad 0.55)
  Top 0.143: R42.1 24.5,29.25 v24.25,29.25
  Bottom 0.143: U3.K2 16.5,26.65 16.5,28.31 TP2.P$1 17.77,29.54 23.96,29.54 v24.25,29.25
  other vias: 16.73,26.43
N$22  (via drill 0.2 pad 0.35, 0.3 pad 0.55)
  Top 0.143: R43.1 24.62,18.5 24.53,18.59 24.53,19.22 v24.5,19.25
  Bottom 0.1: 18.5,22.85 18.84,22.85
  Bottom 0.143: U3.H7 18.35,22.85 18.5,22.85 | v24.5,19.25 22.62,19.25 21.75,20.12 21,20.12 19.25,21.88 19.25,22.6 19,22.85 18.84,22.85
  other vias: 18.02,23.18
N$23
  pour Top (no thermals): 8.23,25.67 8.21,25.69 7.81,26.08 7.8,26.11 7.8,26.84 7.38,27.26 5.74,27.26 5.45,26.97 5.45,24.53 5.78,24.2 9.17,24.2 9.17,25.34 8.84,25.67
N$24
  Top 0.152: U3.B1 23.5,28.65 R11.2
N$25  (via drill 0.2 pad 0.33, 0.3 pad 0.55)
  Top 0.203: R34.2 21.62,19.25 v21.62,19.38
  Bottom 0.203: U3.G9 18.75,21.88 21.25,19.38 v21.62,19.38
  other vias: 18.68,21.88
N$26
  Top 0.254: C53.2 R66.1 4.25,34.25 MNT1.P$1
  pour Top (isolate 0.203, no thermals): -0.19,30.93 3.58,30.93 3.93,30.96 4.28,31.04 4.61,31.16 4.92,31.33 5.21,31.54 5.46,31.79 5.67,32.08 5.84,32.39 5.96,32.72 6.04,33.07 6.07,33.42 6.07,37.94 -0.19,37.94
N$44
  Top 0.152: R21.1 R58.2 1.93,19.7 Q7.1
N$94  (via drill 0.2 pad 0.35, 0.3 pad 0.55)
  Top 0.152: v10.23,20.12 8.75,20.12 7.75,19.12 R32.1
  Bottom 0.152: U3.K8 16.06,21.86 13.12,21.86 11.39,20.12 v10.23,20.12
  other vias: 16.73,22.52
N$95  (via drill 0.2 pad 0.35, 0.3 pad 0.55)
  Top 0.152: v8.88,19.45 9,19.33 R37.1
  Bottom 0.152: U3.M8 15.18,22.77 10.9,22.77 10,21.88 10,21.38 8.88,20.25 v8.88,19.45
  other vias: 15.43,22.52
N$96  (via drill 0.2 pad 0.35, 0.3 pad 0.55)
  Top 0.152: R36.1 10.25,18.92 9.73,19.45 v9.69,19.45
  Bottom 0.152: U3.L8 15.69,22.14 15.01,22.14 14.77,22.38 11,22.38 10.29,21.67 10.29,21.21 9.69,20.61 v9.69,19.45
  other vias: 16.07,22.52
N$97
  Top 0.1: 16.27,20.9 15.22,20.9
  Top 0.102: U3.K9 16.4,21.55 16.4,21.03 16.27,20.9 | 15.22,20.9 15.07,20.74 15.07,20.34 14.73,20 12.75,20 12.37,19.61 11.89,19.61 11.5,19.22 R33.1
N$99
  Top 0.1: 17.02,22.85 15.9,22.85
  Top 0.113: U3.J8 17.35,22.52 17.02,22.85 | 15.9,22.85 15.75,23 15.75,24 15.61,24.14 14.23,24.14 R35.1
N$108  (via drill 0.2 pad 0.35)
  Bottom 0.152: U3.H3 18.02,26.24 18.59,26.81 TP3.P$1
  other vias: 18.02,25.77
N$110
  Top 0.113: U3.C7 21.59,22.86 22.75,22.86 23.12,22.49 23.12,22.29 23.88,21.54 R12.2
N$120  (via drill 0.3 pad 0.55)
  Top 0.152: v9.88,29.88 10.25,29.88 R8.1 C10.1
  Top 0.203: v9.88,29.88 9.9,29.85 9.9,28.95 9.78,28.82 U2.5 | C10.1 R5.2
N$157
  Top 0.152: U2.1 5.8,28.82 5.25,29.38 R10.1 R9.1
RK628_INTN_3V3  (via drill 0.3 pad 0.55)
  Top 0.1: 17.71,27.6 17.71,26.11 U3.J3
  Top 0.113: v16.19,29.05 16.19,30.18 15.5,30.88 15.38,30.88 R2.1
  Top 0.152: J6.5 18.25,38.75 18.62,38.38 v18.62,37.76 | 17.71,27.6 16.25,29.05 v16.19,29.05
  Bottom 0.152: v18.62,37.76 19.61,37.76 20.75,36.62 20.75,34.44 19.5,33.19 TP4.P$1 19.33,32.19 v16.19,29.05
RK628_RSTN_3V3  (via drill 0.2 pad 0.35, 0.3 pad 0.55)
  Top 0.152: J6.6 v17.76,38.28 | C5.2 14.12,29.75 14.62,30.25 14.75,30.25 | v15.38,30.25 14.75,30.25 | 14.75,30.25 R56.1
  Bottom 0.152: U3.H4 17.77,25.38 16.5,25.38 13.88,28 TP11.P$1 13.75,29.38 14.62,30.25 v15.38,30.25 15.38,34 17.76,36.39 v17.76,38.28
  other vias: 18.02,25.12
RK628_XTALI
  Top 0.127: U3.M9 14.5,21.88 13.88,22.5 C13.2 13.67,22.5 13.42,22.25 11.75,22.25 11.1,22.9 Y5.1
RK628_XTALO
  Top 0.12: 15.76,21.56 13.81,21.56
  Top 0.127: U3.L9 15.76,21.56 | 13.81,21.56 R6.1
VCC1V1_RK628  (via drill 0.2 pad 0.33, 0.2 pad 0.35, 0.3 pad 0.55, 0.35 pad 0.7)
  Top 0.203: L2.2 v8.5,21.75 | v23.12,20.25 C30.1 23.88,19 24,18.88 24,17.25 23.57,16.82 FB1.1 | C10.2 R5.1 v12.38,28.12
  Route15 0.203: v9.88,23.62 10.5,24.25 10.5,26.25 v12.38,28.12
  other vias: 20.62,22.52 19.98,21.88 7.62,21.75 9.38,21.75 24.54,16.78 23.12,21 25.29,16.03
  pour Top (no thermals): 9.56,24.08 9.17,23.69 9.14,23.67 5.78,23.67 5.45,23.34 5.45,21.41 5.78,21.08 9.47,21.08 9.8,21.41 9.8,23.14 9.81,23.17 10.46,23.81 10.48,23.83 11.47,23.83 11.71,24.06 11.73,24.08 12.84,24.08 13.05,24.28 13.05,24.72 12.97,24.8 9.66,24.8 9.58,24.72 9.58,24.11
  pour Bottom (no thermals): 19.83,21.66 21.03,20.45 22.39,20.45 22.42,20.44 22.91,19.95 23.42,19.95 23.42,21.09 21.84,22.67 20.41,22.67 19.83,22.09
  pour Route15 (no thermals): 11.74,19.86 15.17,16.43 23.27,16.43 24.4,15.3 25.73,15.3 25.95,15.52 25.95,16.48 23.7,18.73 23.7,20.98 23.48,21.2 20.98,21.2 20.16,22.02 19.92,22.02 19.77,21.87 19.77,20.94 19.11,20.29 15.27,20.29 14.7,20.85 14.7,22.73 13.23,24.2 11.15,24.2 10.02,23.07 8.15,23.07 7.3,22.23 7.3,20.52 7.97,19.86
  pour Top (no thermals): 23.29,15.73 25.46,15.73 25.77,16.04 25.77,16.83 25.46,17.15 23.29,17.15 23.23,17.08 23.23,15.79
VCC5V_HDMI_RX  (via drill 0.25 pad 0.4, 0.3 pad 0.55)
  Top 0.152: v6.5,17 R26.1 | R21.2 v4,17.12 | C18.2 8.25,12.5 v8.25,12.38 8.25,12.25 | R27.1 10.21,16.25 10.07,16.39 v10.07,16.81
  Route15 0.152: v8.25,12.38 7.25,13.38 6.88,13.38 6.5,13.75 v6.5,17 7.25,16.25 9.88,16.25 10.07,16.44 v10.07,16.81
  Bottom 0.203: v6.5,17 6.38,17.12 TP14.P$1 v4,17.12
  other vias: 10.62,8.88 9.88,8.88
  pour Top (no thermals): 6.02,12.43 7.77,12.43 9.18,11.02 9.18,8.9 9.65,8.43 10.85,8.43 11.19,8.77 11.19,11.48 11.1,11.57 10.9,11.57 10.81,11.48 10.81,9.35 10.65,9.19 10.1,9.19 9.94,9.35 9.94,11.1 8.44,12.6 8.44,12.98 8.1,13.32 5.9,13.32 5.81,13.23 5.81,12.65
  pour Route15 (isolate 0.203, no thermals): 8.59,11.56 8.6,11.52 8.6,9.29 9.54,8.35 10.71,8.35 10.9,8.54 10.9,10.46 8.66,12.69 8.65,12.73 8.65,14.52 8.66,14.56 10.15,16.04 10.15,16.96 9.71,17.4 6.54,17.4 6.1,16.96 6.1,14.04
VCC_3V3  (via drill 0.2 pad 0.35, 0.3 pad 0.55)
  Top 0.203: v21,37.88 21,37.75 C52.1 | R25.2 v2.75,11.5 | R23.2 2.25,27.38 v2.12,27.38 | R9.2 v3,28.12 | v23.34,34.92 23.34,34.62 23.23,34.5 R48.2 | R56.2 R2.2 v13.62,32.75 | R1.2 v12.5,26.62
  Top 0.305: FB3.1 10.3,32.46 v10.07,32.69
  Route15 0.203: 19.88,13.25 19,14.12 18.47,14.12 | 7.25,22.88 8,23.62 9.12,23.62 | 13.01,24.64 13.5,25.12 16.88,25.12 17,25 17.5,25 U3.H5
  Bottom 0.254: v12.5,26.62 11.22,26.62 v9.9,27.94 9.18,27.94 v9.15,27.92
  other vias: 18.02,24.48 10.69,32.69 21,38.62 20.38,38.25
  pour Route15 (rank 2, no thermals): 8.56,37.6 8.56,34.6 1.06,27.1 1.06,12.65 3.02,10.68 5.48,10.68 7.6,12.81 11.48,12.81 11.48,12.81 11.5,12.81 11.52,12.81 11.52,12.81 20.07,12.68 20.07,13.23 17.23,16.07 12.85,16.07 9.98,18.94 8.48,18.94 7.07,20.35 7.07,22.4 8.1,23.43 9.98,23.43 10.98,24.43 13.4,24.43 13.52,24.31 18.1,24.31 18.22,24.42 18.22,24.7 15.85,27.07 14.85,27.07 12.07,29.85 12.07,33.02 12.35,33.31 12.77,33.31 13.52,32.56 14.48,32.56 15.85,33.93 23.6,33.93 23.94,34.27 23.94,35.1 22.19,36.85 22.19,38.85 21.35,39.69 10.65,39.69
  pour Top (no thermals): 10.73,32.94 9.85,32.94 9.57,33.23 9.57,34.73 9.35,34.94 8.4,34.94 8.18,34.73 8.18,32.02 9.15,31.06 10.6,31.06 10.82,31.27 10.82,32.85
  pour Top (no thermals): 20.06,40.32 20.06,37.9 20.43,37.52 20.43,35.52 20.77,35.18 21.94,35.18 21.94,39.35 20.98,40.32
  pour Top (rank 2, no thermals): 10.36,27.3 10.33,27.31 10.19,27.46 10.17,27.48 10.17,28.09 9.97,28.3 8.83,28.3 8.83,26.66 9.16,26.33 11.09,26.33 11.17,26.41 11.17,27.09 10.97,27.3
  pour Bottom (isolate 0.203, no thermals): 20.91,37.6 22.91,37.6 23.43,38.12 23.43,41.89 22.84,42.48 20.98,42.48 20.11,41.62 20.11,38.39
VCCA1V1_RK628  (via drill 0.2 pad 0.33, 0.2 pad 0.35, 0.3 pad 0.55)
  Top 0.152: C32.2 v23.88,23.65
  Top 0.203: v20.38,19.25 20.38,18.62 C27.2
  Bottom 0.113: 18.5,20.88 18.5,21.4 U3.H9 U3.J9
  other vias: 18.02,21.88 17.38,21.88 17.38,23.18 21.27,24.48 20.62,25.12 19.98,25.77 19.32,25.77 19.62,19.25 24.77,23.65 25.73,23.64 26.68,23.63
  pour Bottom (no thermals): 19.15,25.43 19.9,25.43 23.15,22.18 27.07,22.18 27.07,24.02 24.1,24.02 22.73,25.4 20.78,25.4 20.1,26.07 19.27,26.07 19.05,25.85 19.05,25.52
  pour Bottom (no thermals): 17.27,21.68 17.77,21.68 18.3,21.15 18.3,18.9 20.4,16.8 24.85,16.8 27.07,19.02 27.07,24.07 23.68,24.07 23.68,23.85 23.18,23.35 23.18,22.15 23.68,21.65 23.68,18.98 23.65,18.95 21.1,18.95 18.95,21.1 18.95,21.98 17.6,23.32 17.18,23.32 17.18,21.77
  pour Top (no thermals): 19.92,18.61 19.92,16.9 20.3,16.52 20.3,15.15 20.77,14.68 23.48,14.68 23.57,14.77 23.57,15.35 23.48,15.45 22.98,15.45 22.82,15.6 22.82,16.98 22.73,17.07 21.9,17.07 21.52,16.7 20.85,16.7 20.7,16.85 20.7,19.35 20.48,19.57 19.4,19.57 19.35,19.53 19.35,19.17
  pour Top (no thermals): 24.6,23.3 25.27,23.3 25.43,23.15 25.43,22.27 25.52,22.18 26.1,22.18 26.2,22.27 26.2,23.15 26.35,23.3 26.85,23.3 26.95,23.4 26.95,23.85 26.85,23.95 26.35,23.95 26.2,24.1 26.2,24.98 26.1,25.07 25.52,25.07 25.43,24.98 25.43,24.1 25.27,23.95 24.48,23.95 24.32,24.1 24.32,24.98 24.23,25.07 23.52,25.07 23.43,24.98 23.43,22.4 23.65,22.18 24.35,22.18 24.45,22.27 24.45,23.15
VCCA3V3_RK628  (via drill 0.2 pad 0.35, 0.3 pad 0.55)
  Top 0.102: v14.69,19.49 14.12,19.49 C25.2 | C23.2 v13.62,18.5
  Top 0.113: v12.62,32 12.38,31.75 FB3.2
  Top 0.152: C29.2 24.25,25.75 v24.12,25.62 | C26.2 25.38,25.67 v25.43,25.61 | CH1.2 26.5,25.9 v26.21,25.61
  other vias: 15.43,21.23 17.38,21.23 20.62,24.48 19.98,25.12 21.27,25.77 12.62,32.75 12.62,33.5 12.62,31.25
  pour Bottom (no thermals): 13.4,18.18 14.85,18.18 17.7,21.02 17.7,21.35 17.6,21.45 15.27,21.45 13.3,19.48 13.3,18.27
  pour Top (no thermals): 12.59,33.95 12.23,33.95 11.95,34.23 11.95,34.74 11.74,34.95 11.18,34.95 11.18,31.15 11.27,31.05 12.95,31.05 12.95,33.59
  pour Bottom (no thermals): 24.23,24.3 26.95,24.3 26.95,25.48 25.73,26.7 21.77,26.7 21.05,25.98 21.05,25.77 21.17,25.66 22.81,25.68 22.82,25.68 22.84,25.68 22.86,25.68 22.86,25.68 22.86,25.68 22.87,25.66 22.89,25.65 22.89,25.65
  pour Route15 (no thermals): 18.56,27.27 18.56,24.36 18.15,23.94 17.65,23.94 15.18,21.48 15.18,20.9 15.52,20.56 18.98,20.56 19.51,21.09 19.51,21.97 19.85,22.31 20.23,22.31 20.61,21.93 20.98,21.93 22.17,23.12 22.17,27.75 16.85,33.07 15.52,33.07 14.8,32.34 13.45,32.34 12.78,33.02 12.52,33.02 12.43,32.92 12.43,30.02 12.9,29.56 16.27,29.56
  pour Top (no thermals): 13.68,19.73 13.68,18.98 13.52,18.82 12.43,18.82 12.43,18.05 13.65,18.05 14.98,19.38 14.98,19.58 14.73,19.82 13.77,19.82

### Text on the board
tPlace: SDI | SCLK | GND | LRCK | MCLK
bPlace: HDMI to MIPI 22P Board RevA / 08/03/2026